# EasyEDA Pro project ProPrj_K230_2026-10-28.epro, schematic 主板原理图, sheets 1 to 10 of 13

## Sheets
1 Power Architecture Block: Board Name: 立创·庐山派K230-CanMV开发板; Create Date: 2024-11-28; Page Name: Power Architecture Block; Project Name: 立创·庐山派K230-CanMV开发板; Schematic Name: 主板原理图; Update Date: 2025-11-04; Company: 嘉立创EDA; Drawed: LCKFB-YZH; Page Size: A4; Version: V1.0
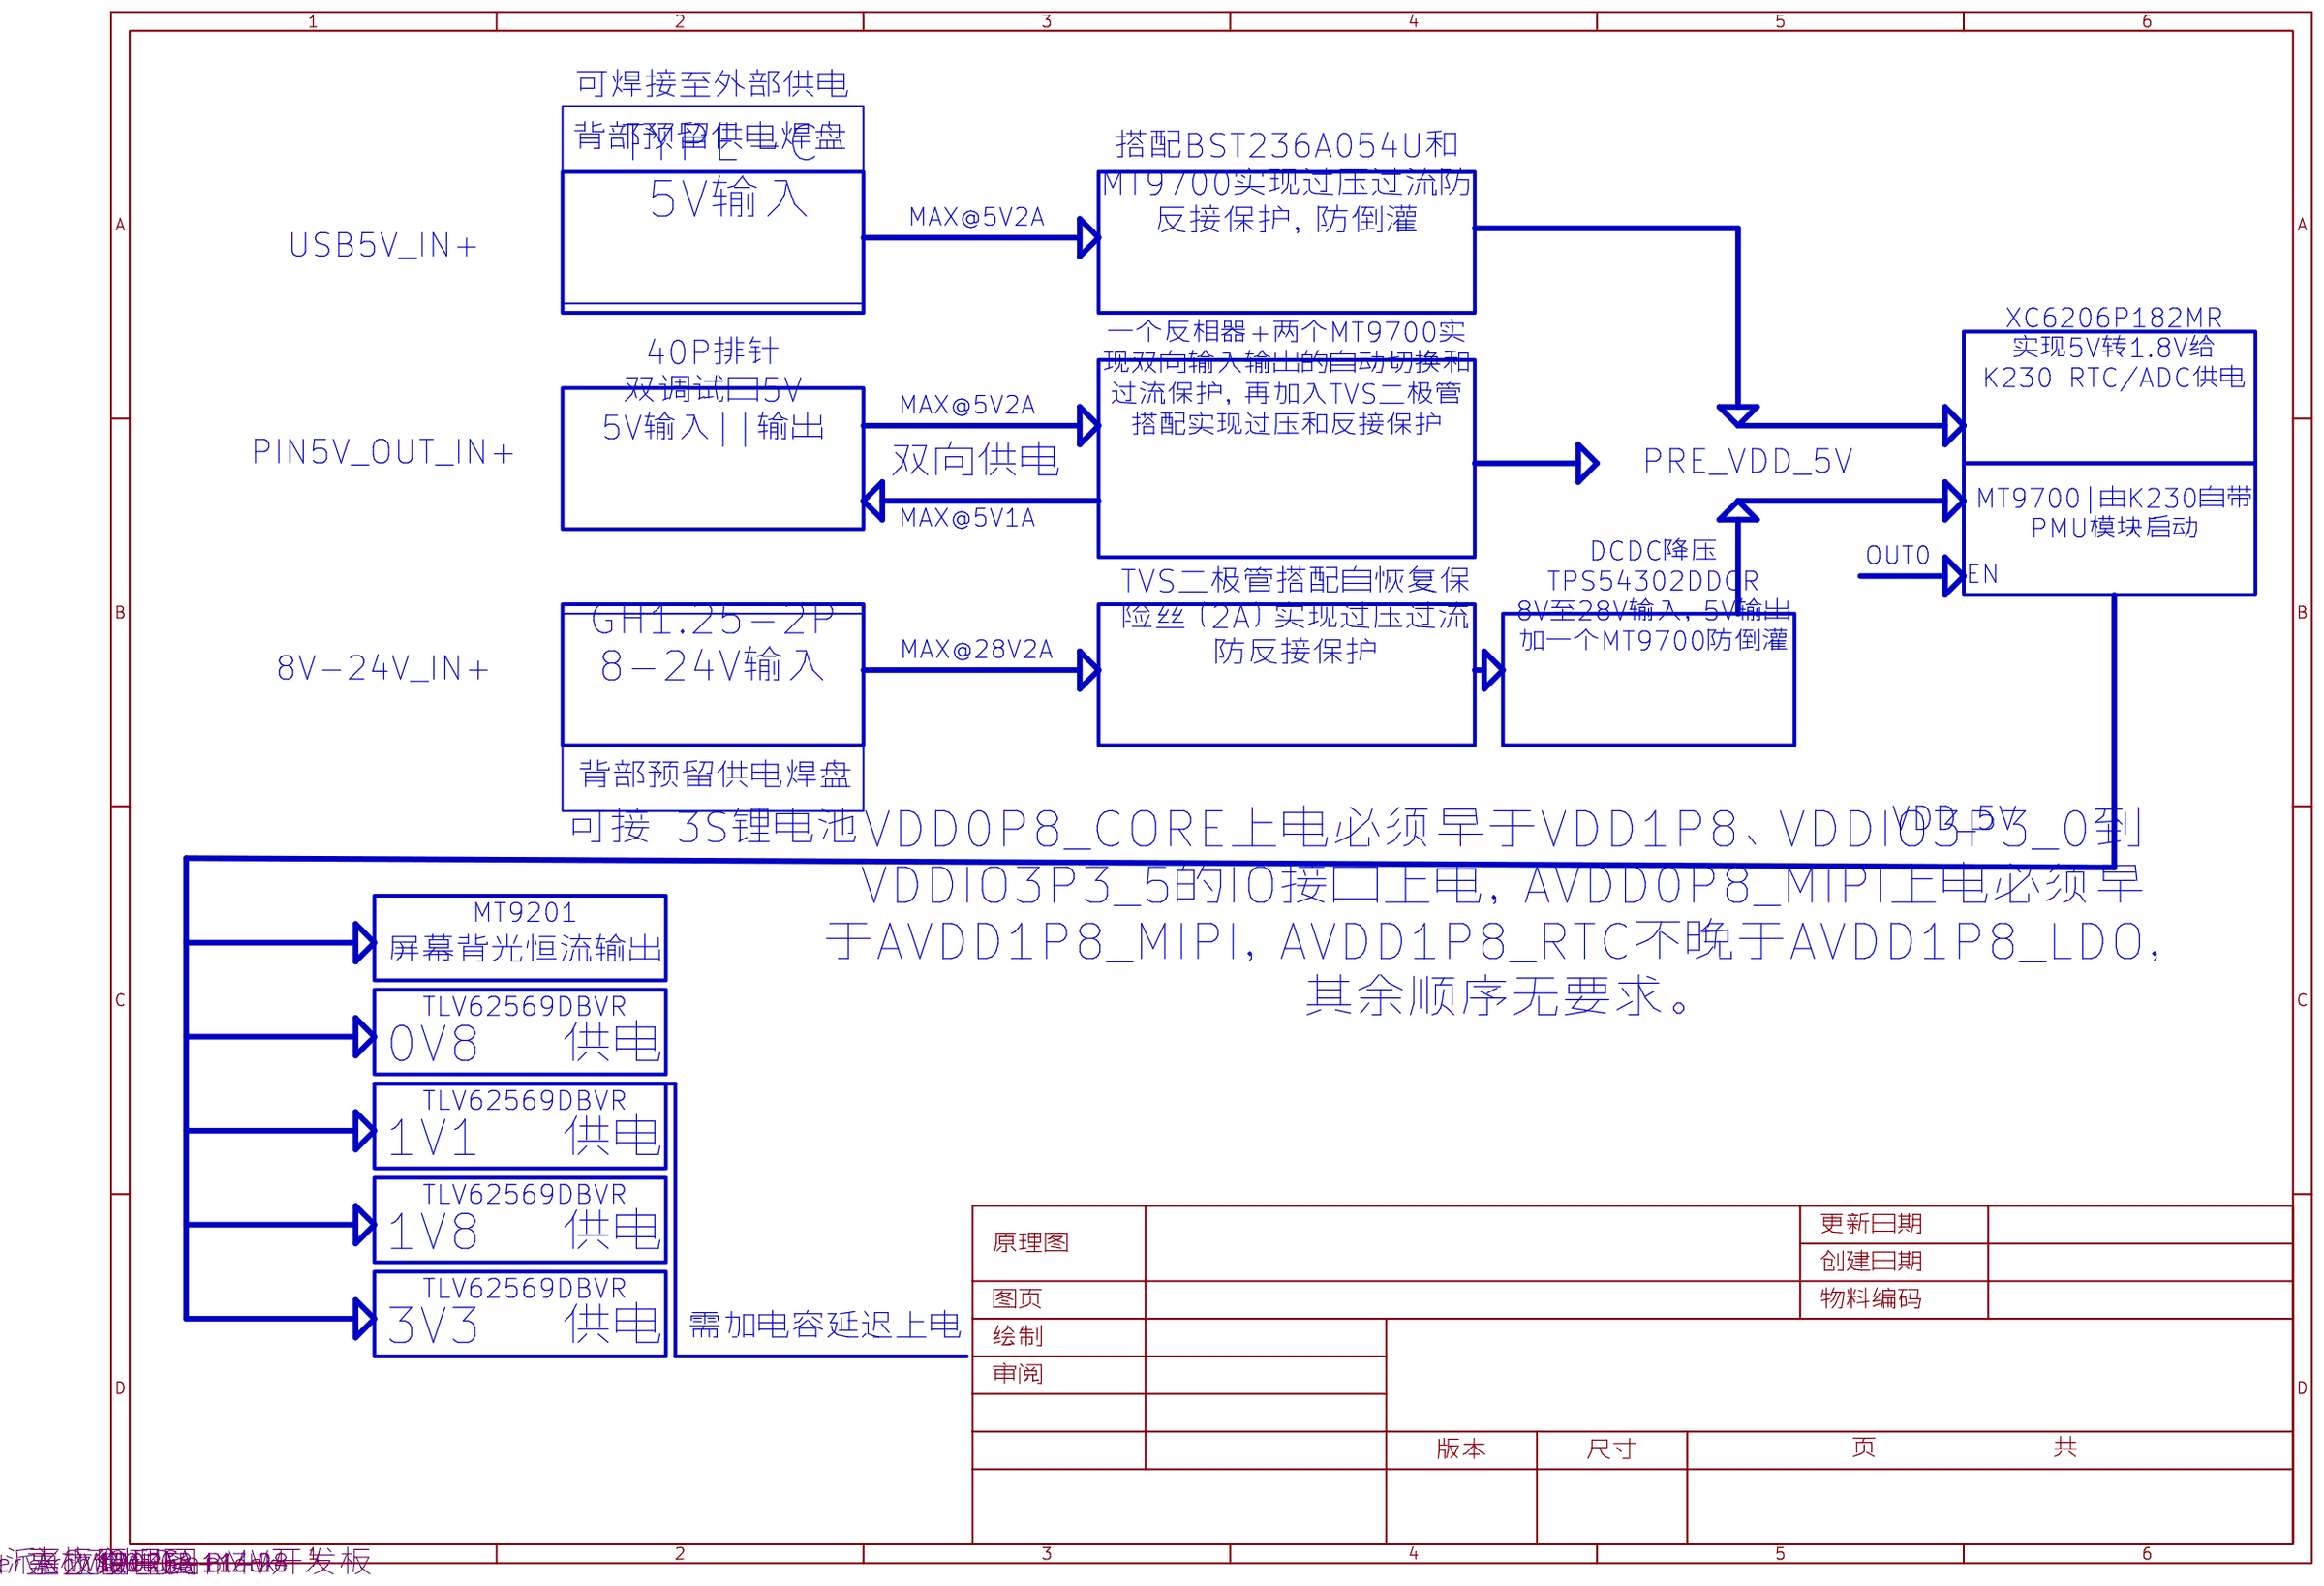
[diagram p0: Power Architecture Block]
2 K230 GPIO: Page Name: K230 GPIO; Update Date: 2024-11-28
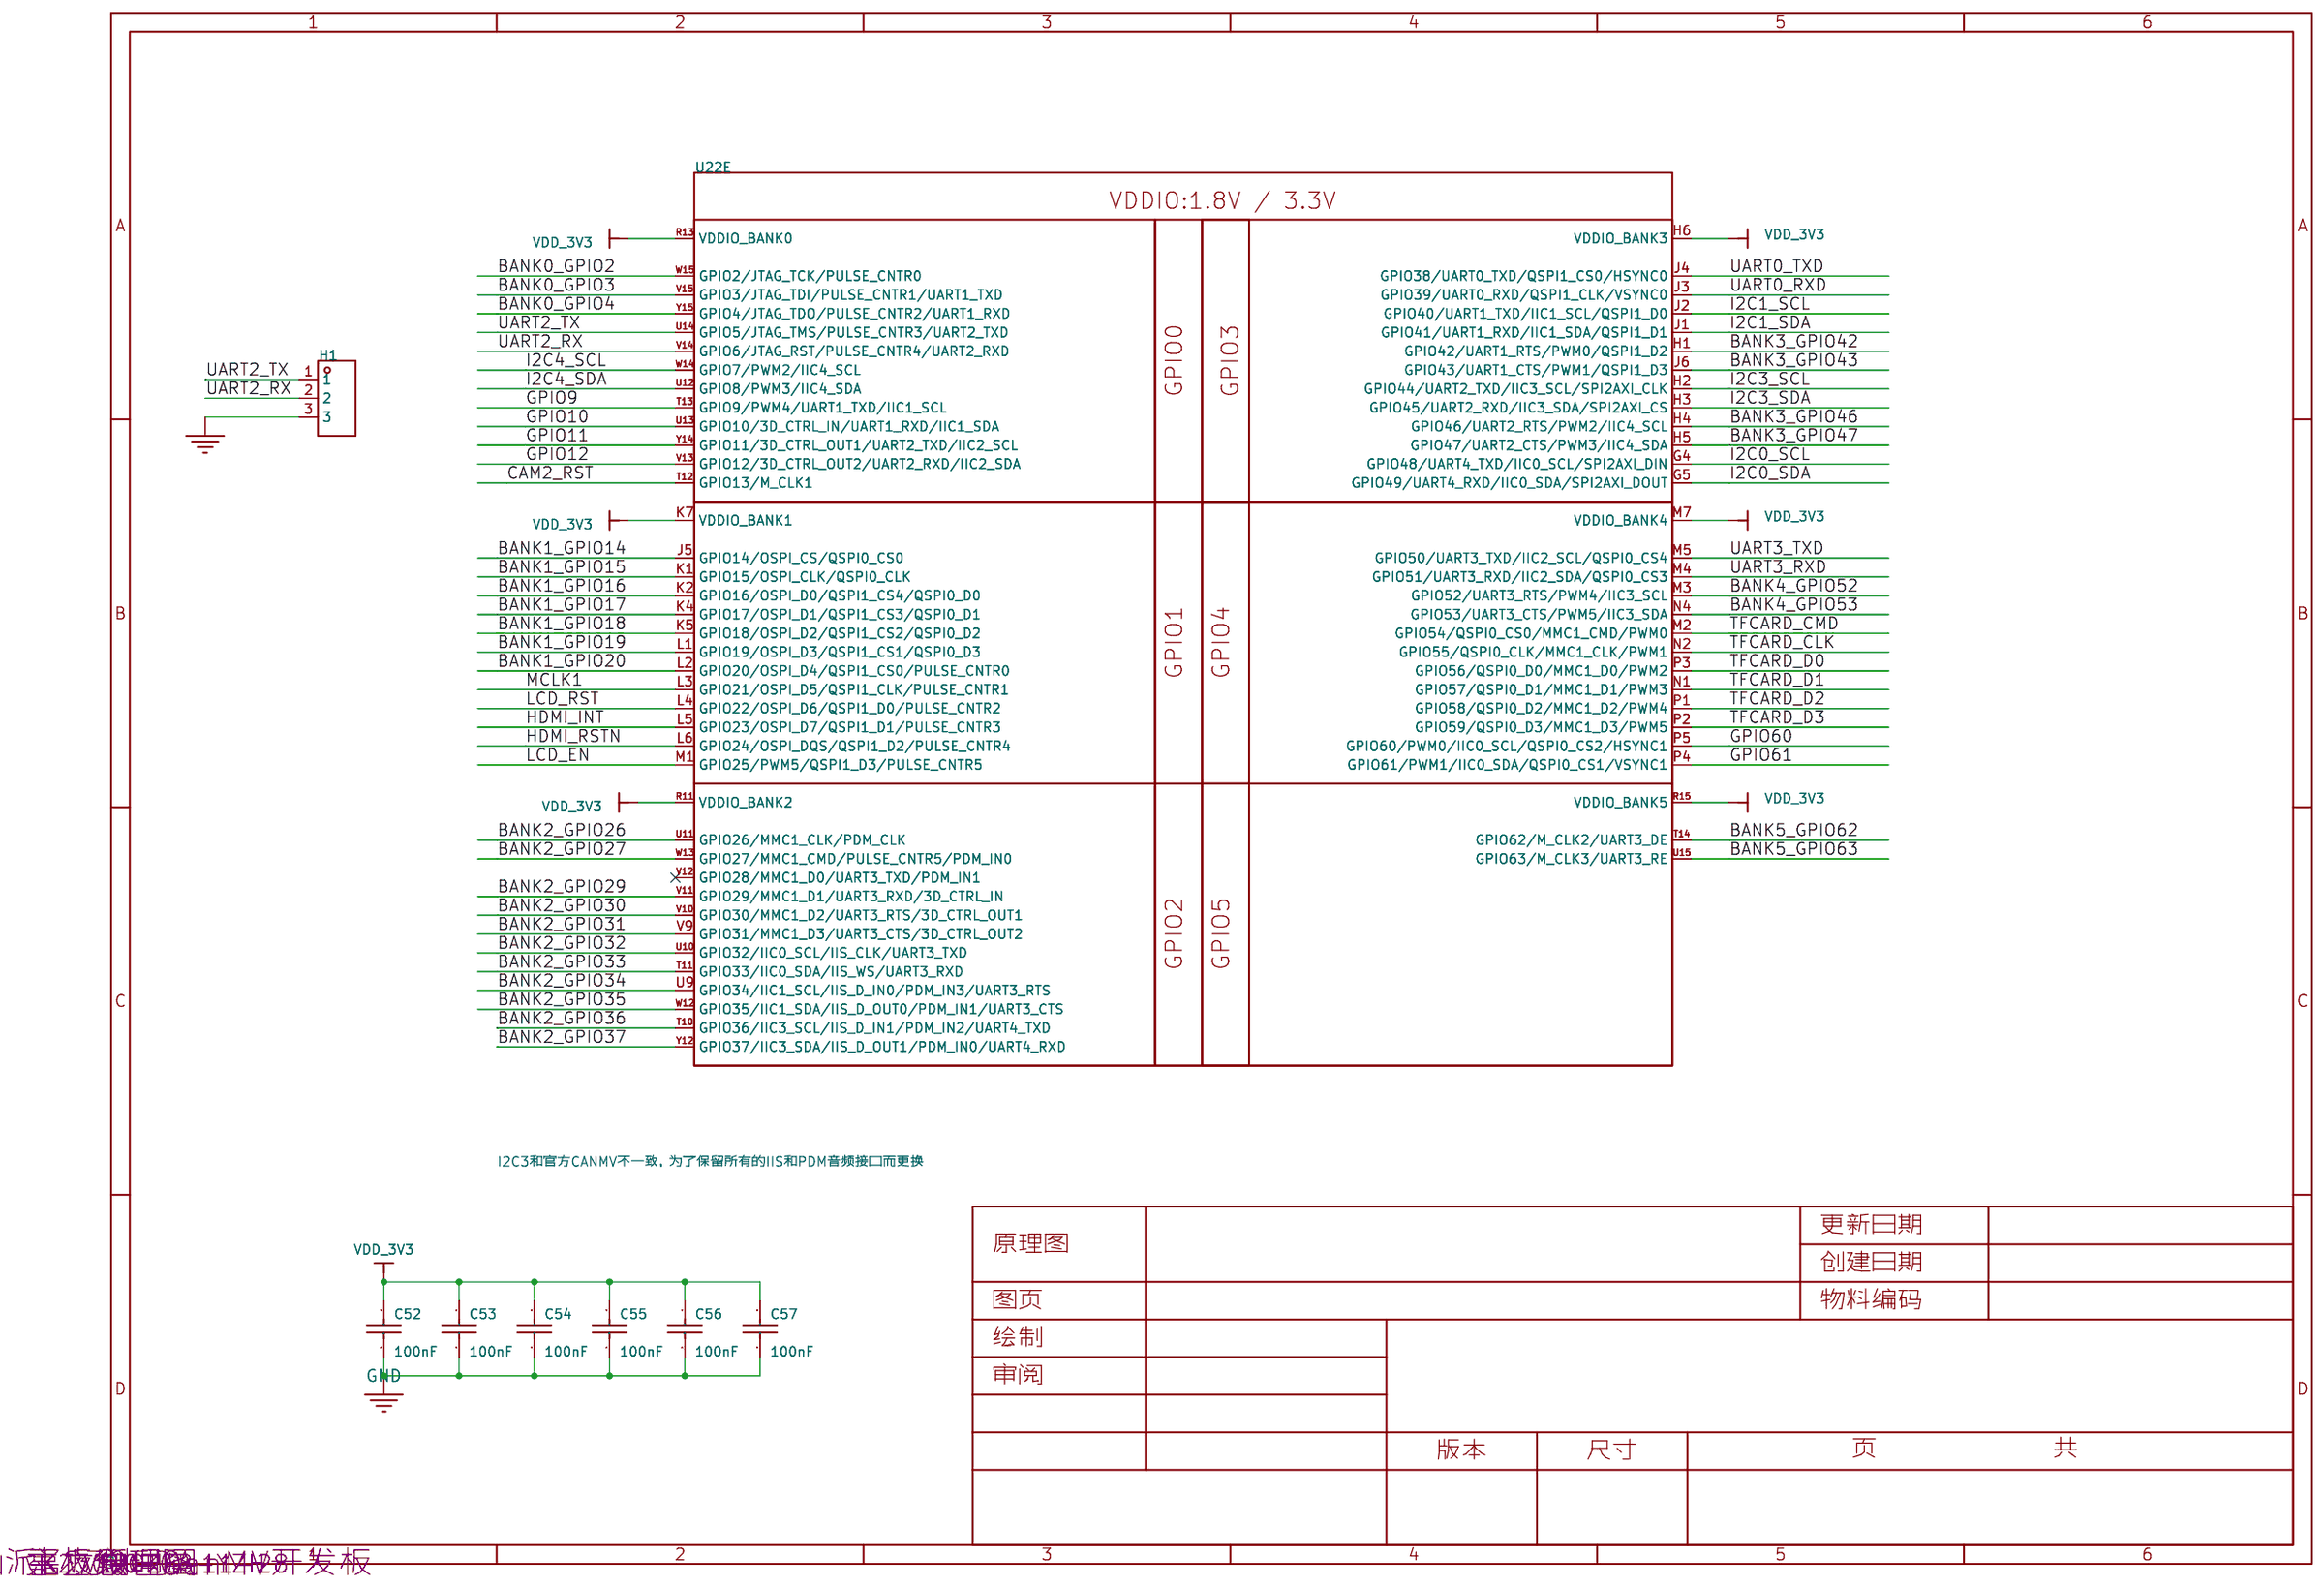
[diagram p1: K230 GPIO]
3 Power SUPPLY USB AND PIN: Page Name: Power SUPPLY USB AND PIN; Update Date: 2024-11-28
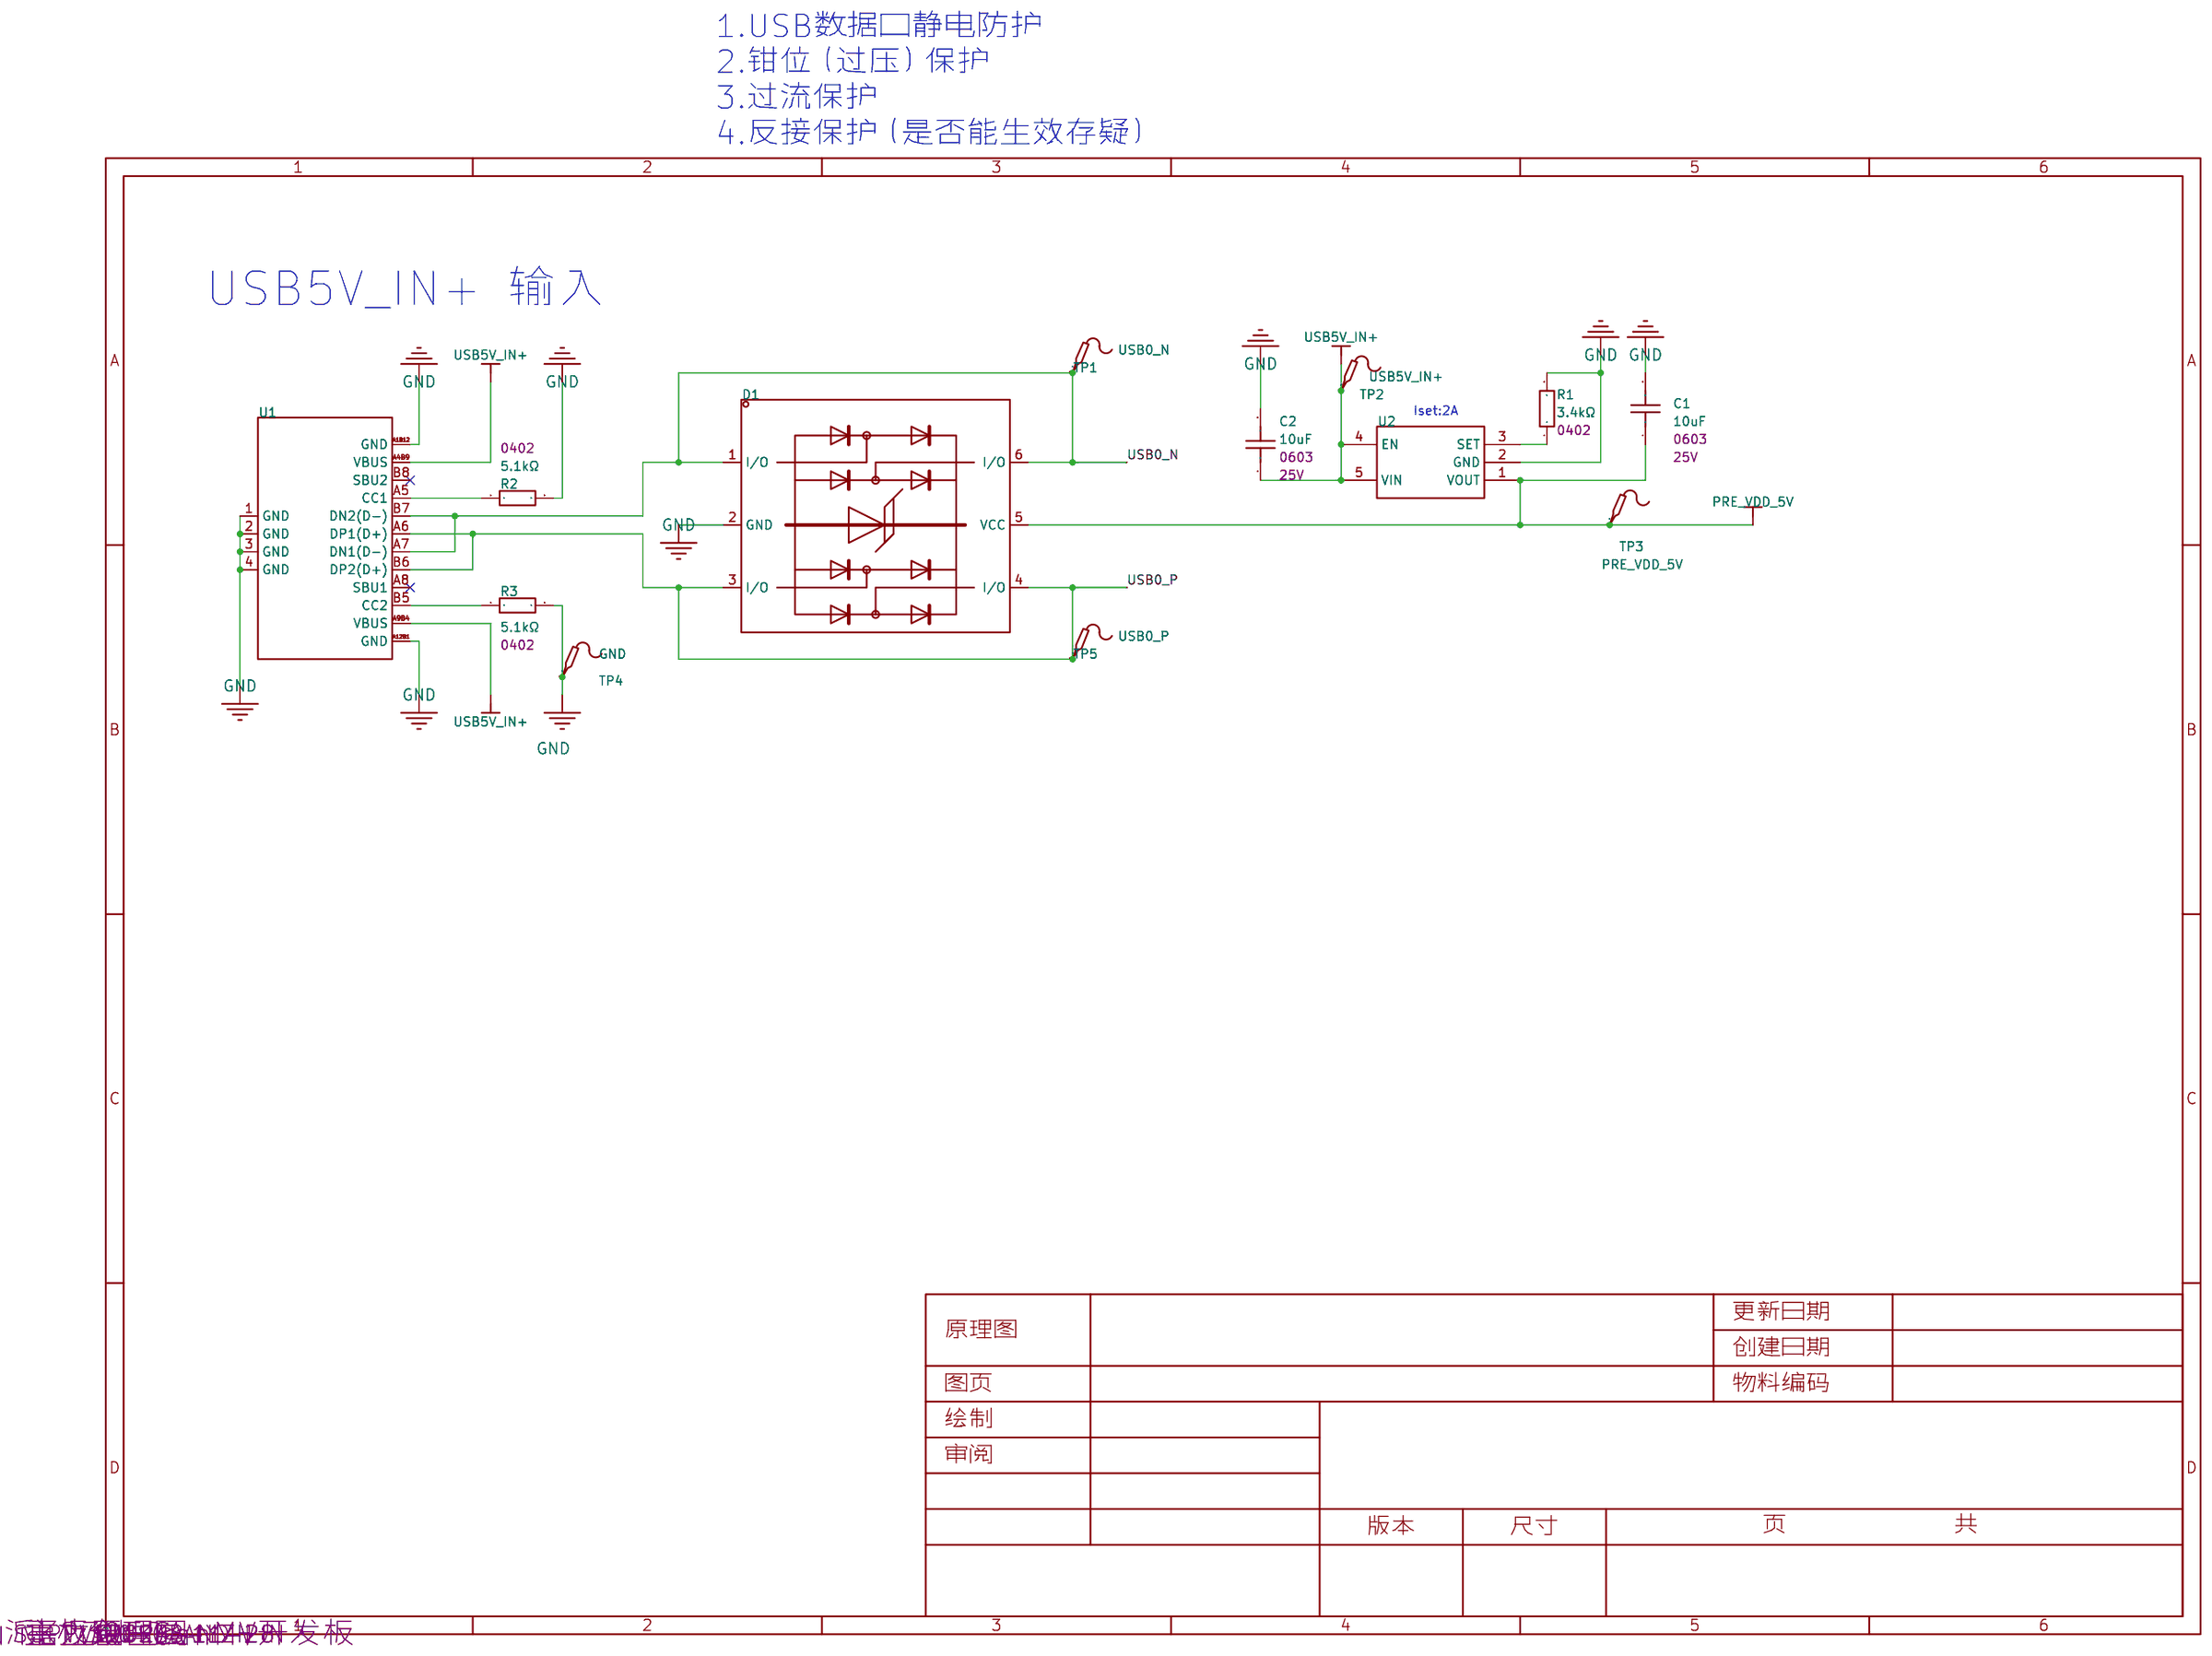
[diagram p2: Power SUPPLY USB AND PIN]
4 Power SUPPLY 8-24V: Page Name: Power SUPPLY 8-24V; Update Date: 2024-11-28
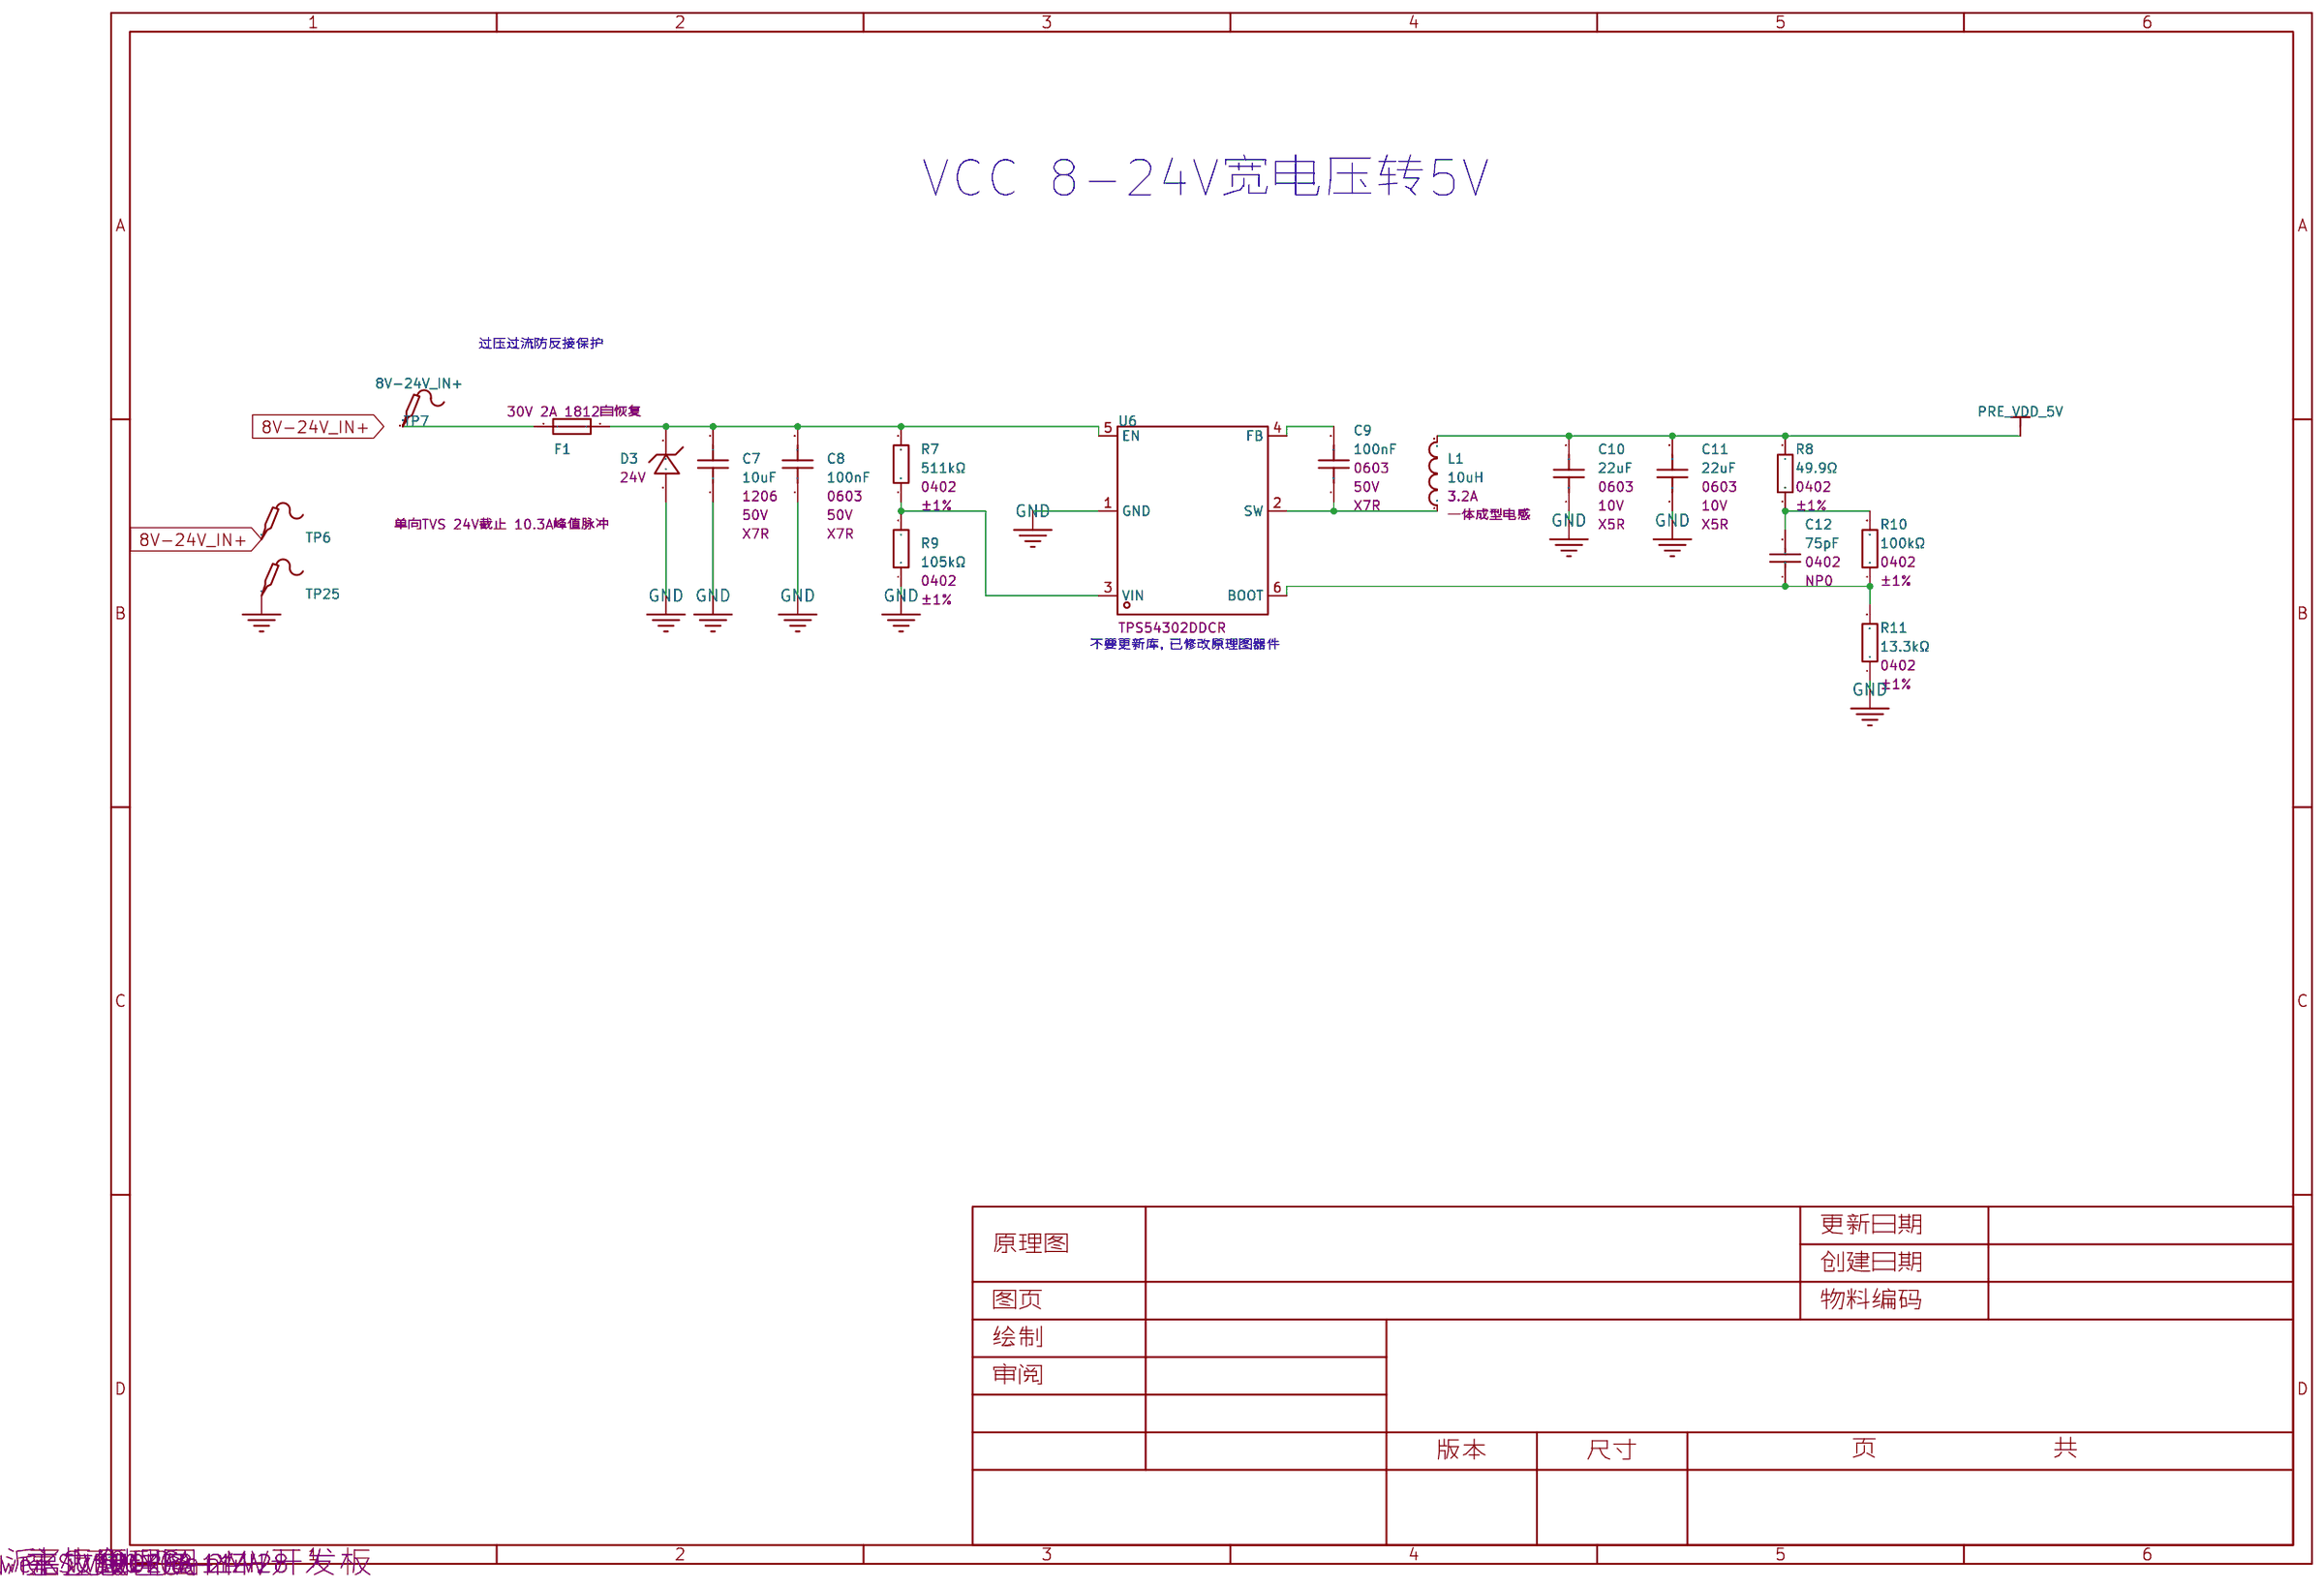
[diagram p3: Power SUPPLY 8-24V]
5 DBG AUDIO KEY LED: Page Name: DBG AUDIO KEY LED; Update Date: 2024-11-28
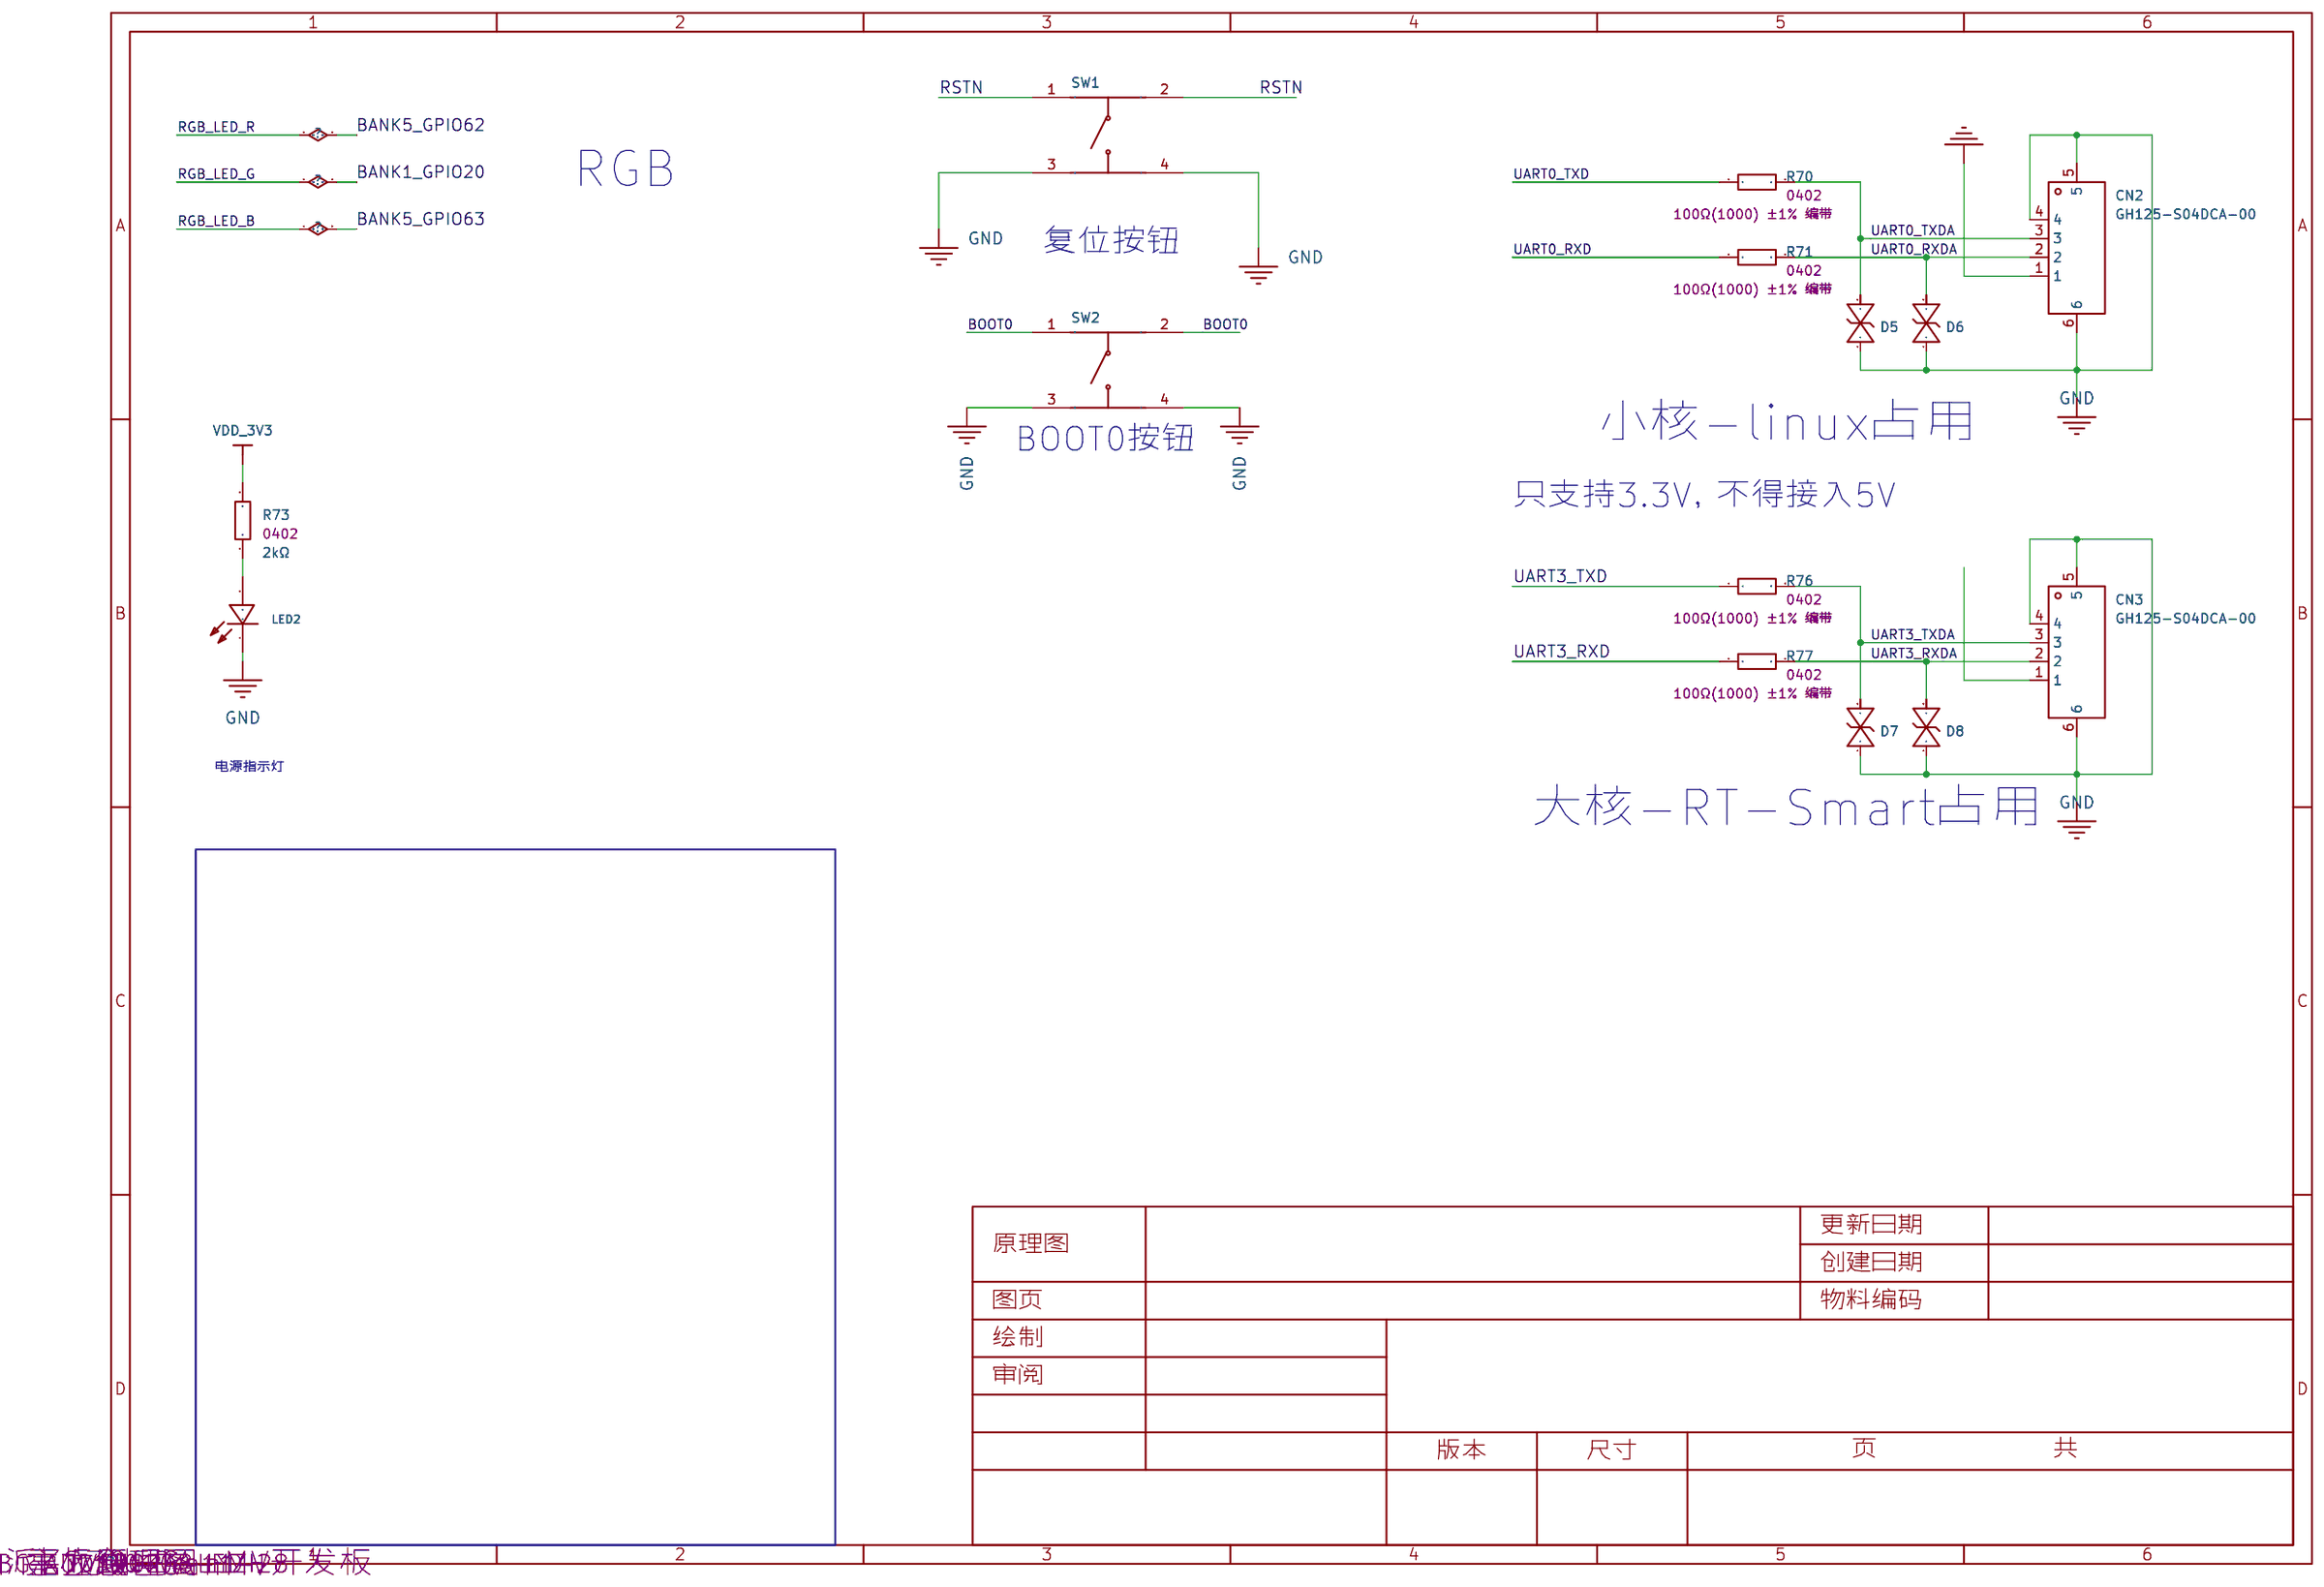
[diagram p4: DBG AUDIO KEY LED]
6 TF CARD OR SDNAND: Page Name: TF CARD OR SDNAND; Update Date: 2024-11-28
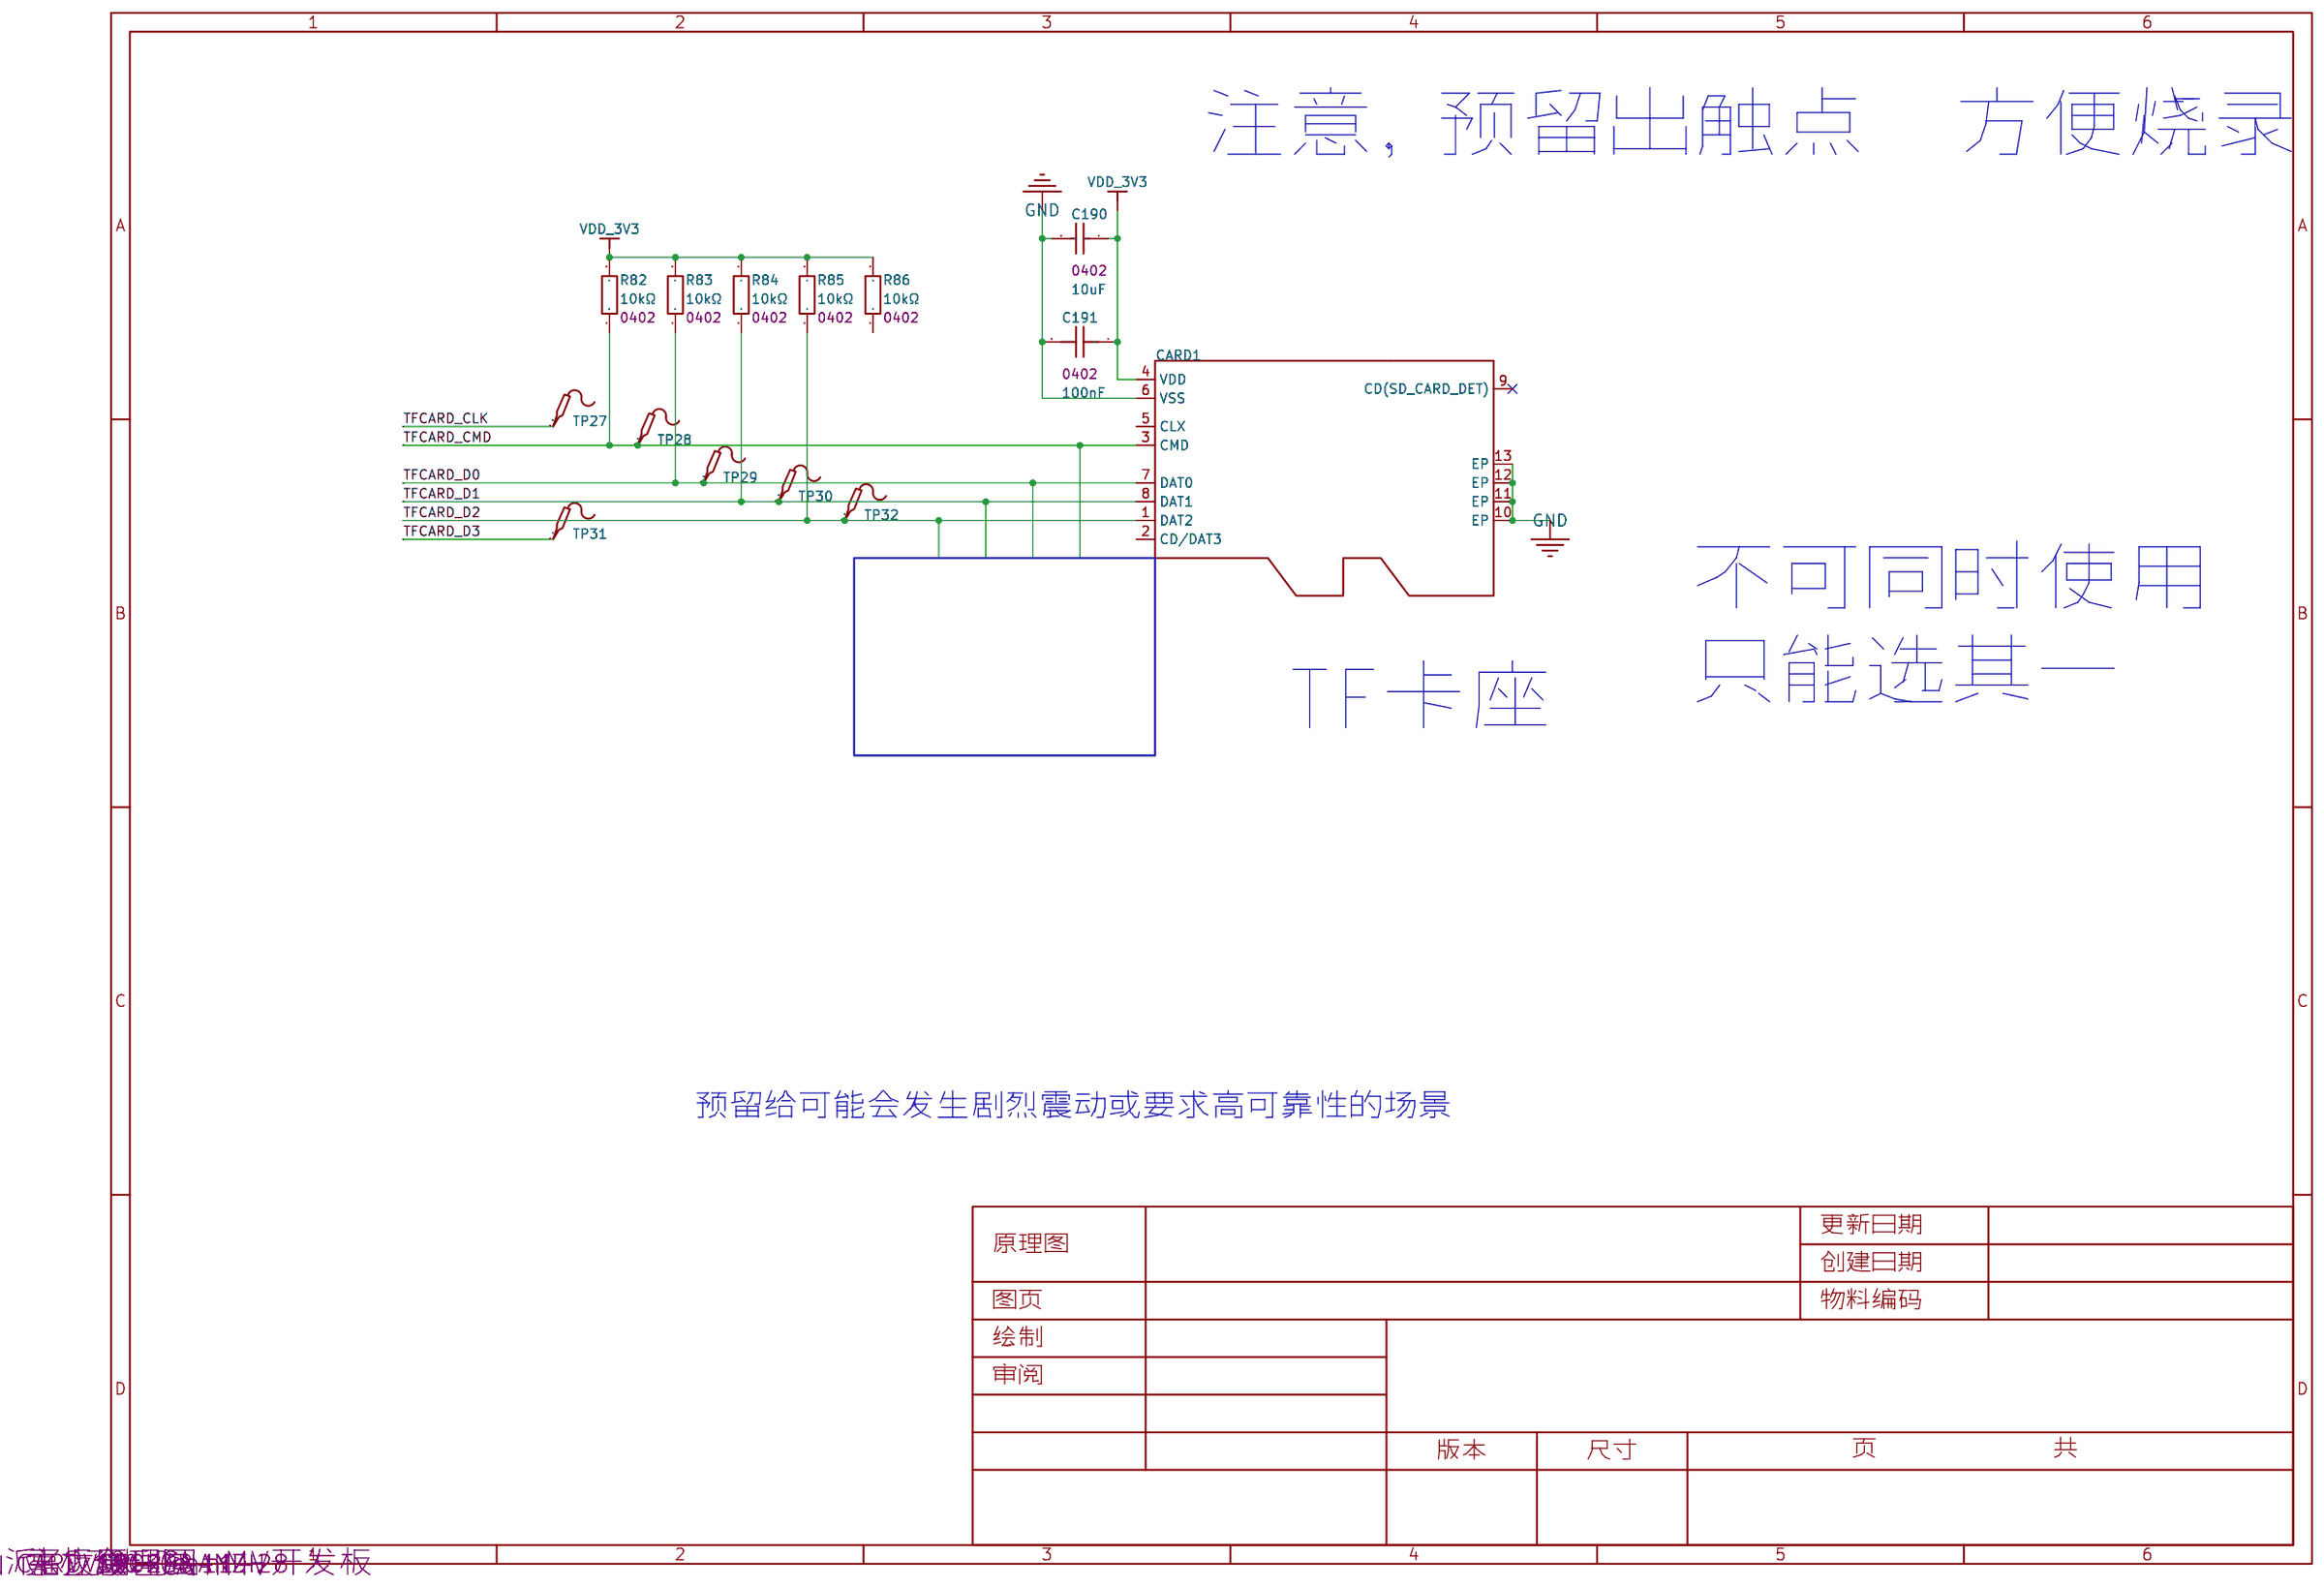
[diagram p5: TF CARD OR SDNAND]
7 Screw Holes: Page Name: Screw Holes; Update Date: 2024-11-28
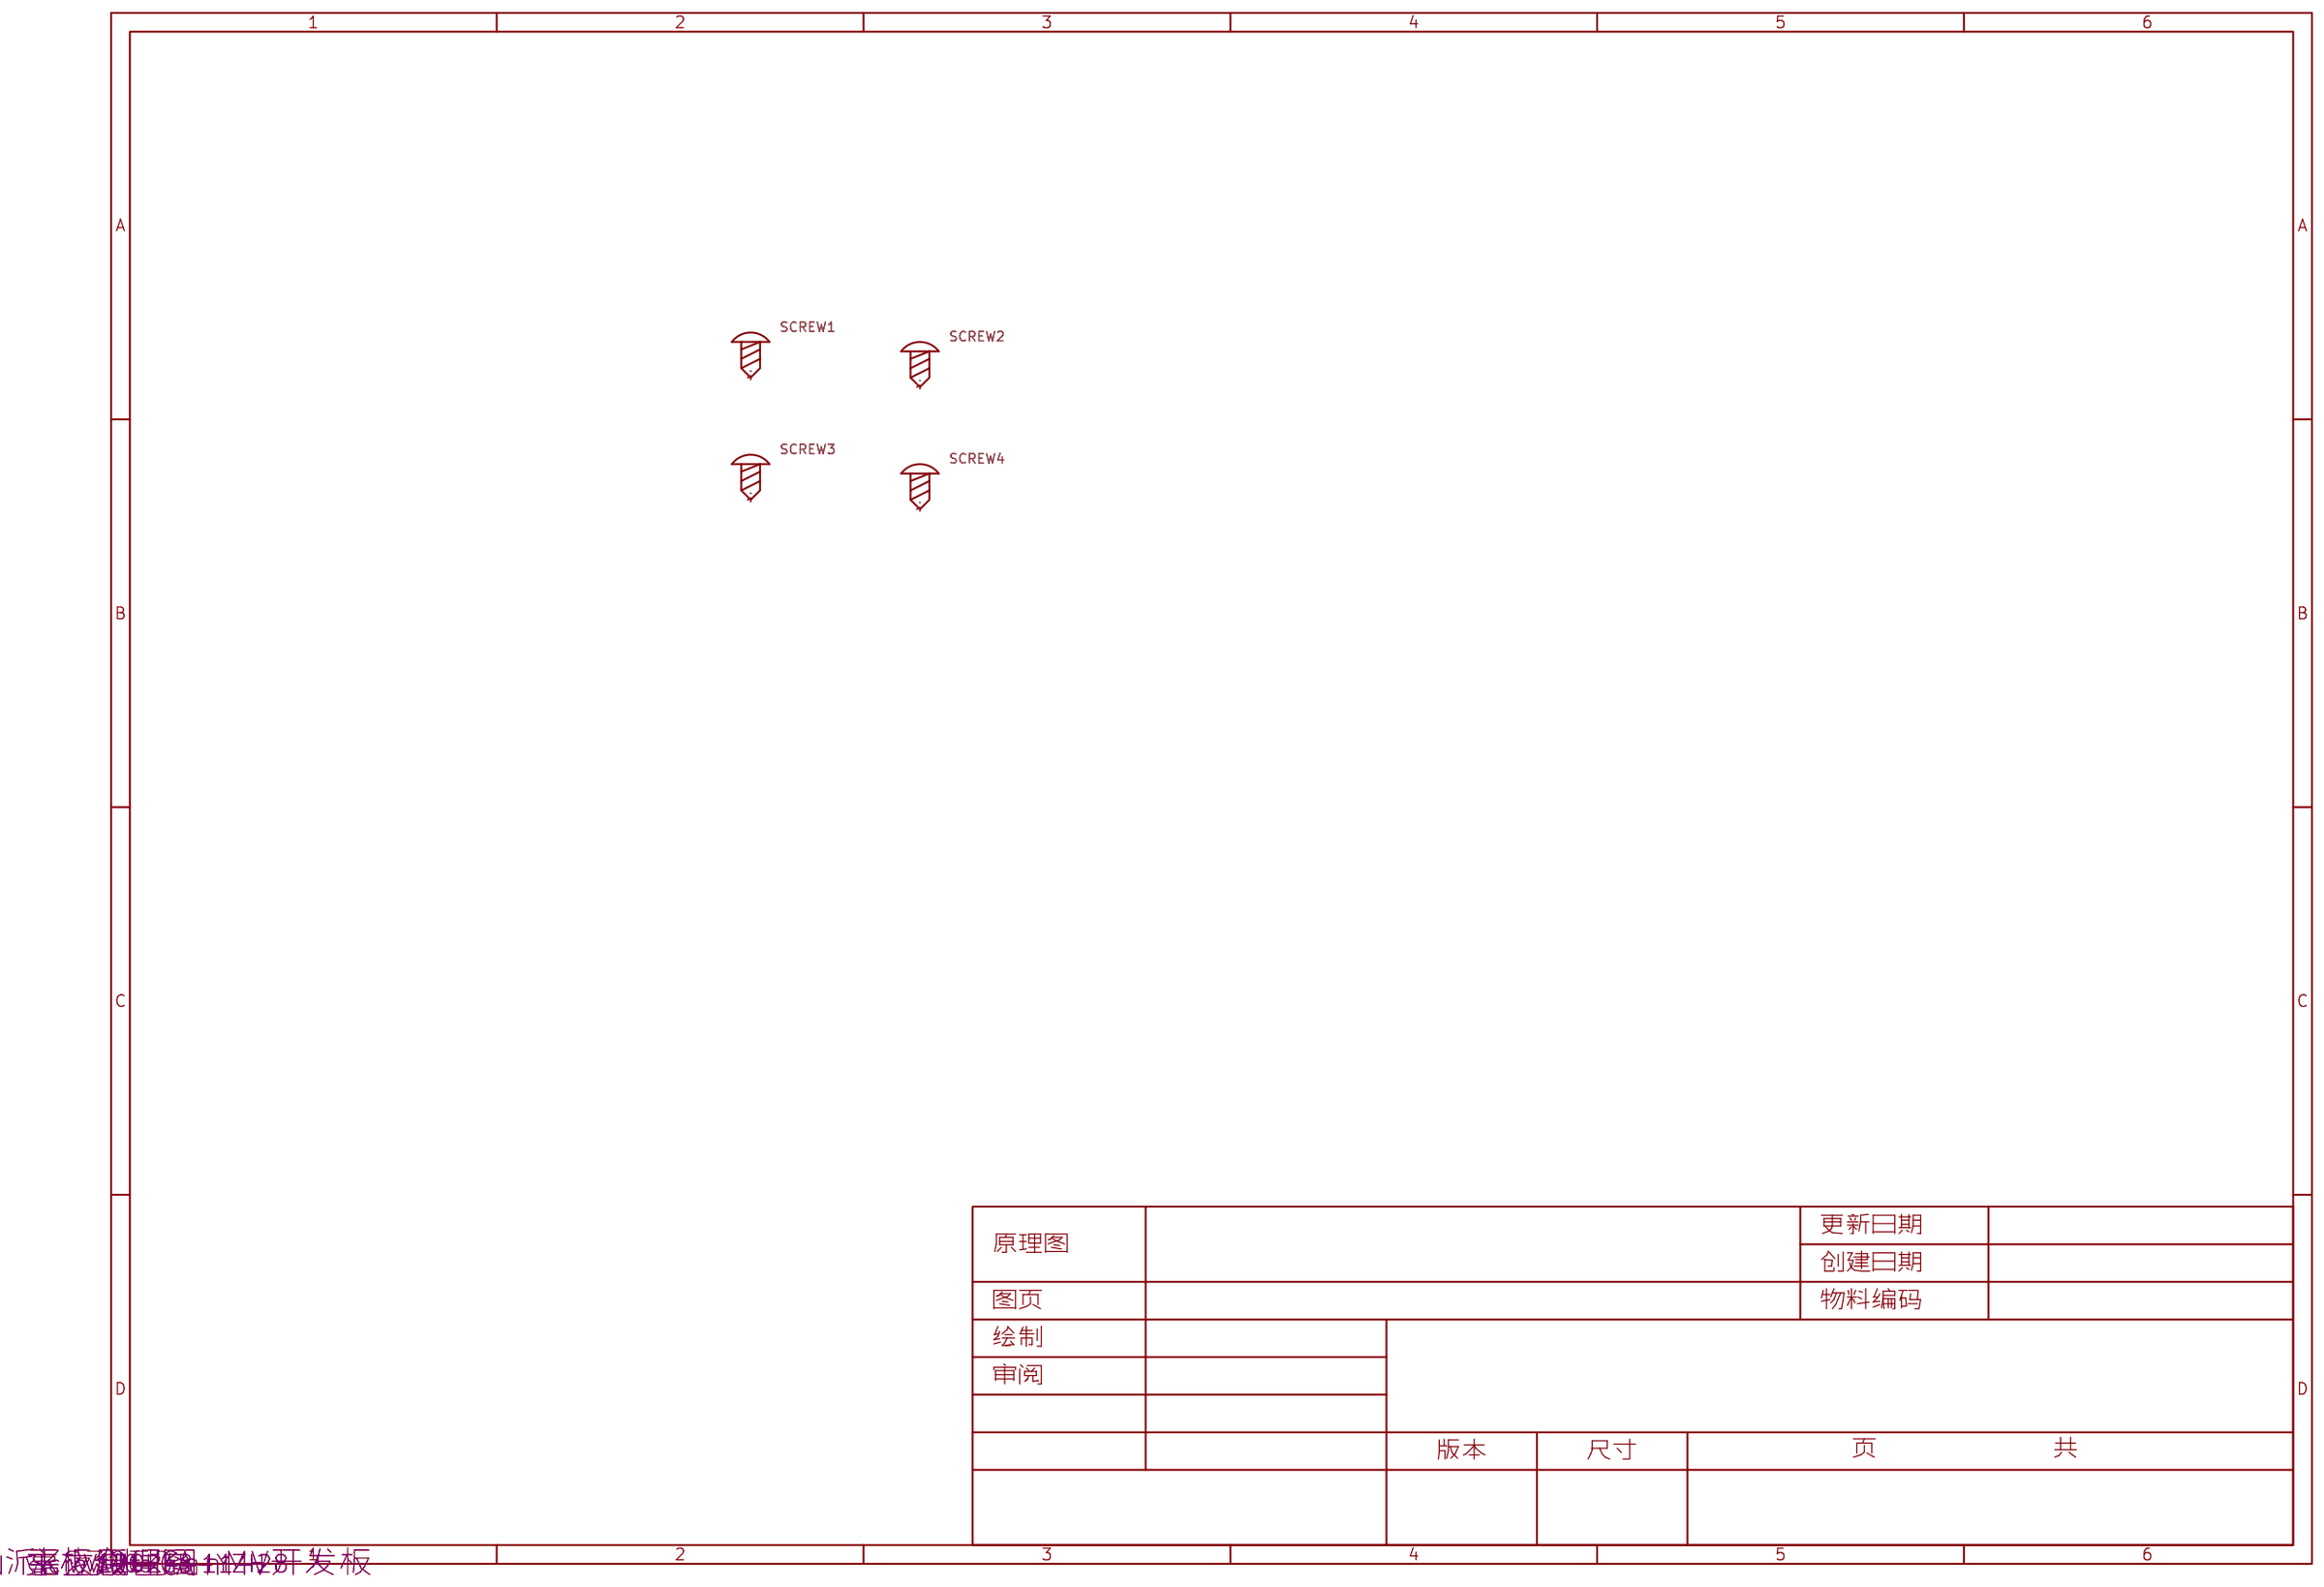
[diagram p6: Screw Holes]
8 K230 BOOT: Page Name: K230 BOOT; Update Date: 2024-11-28
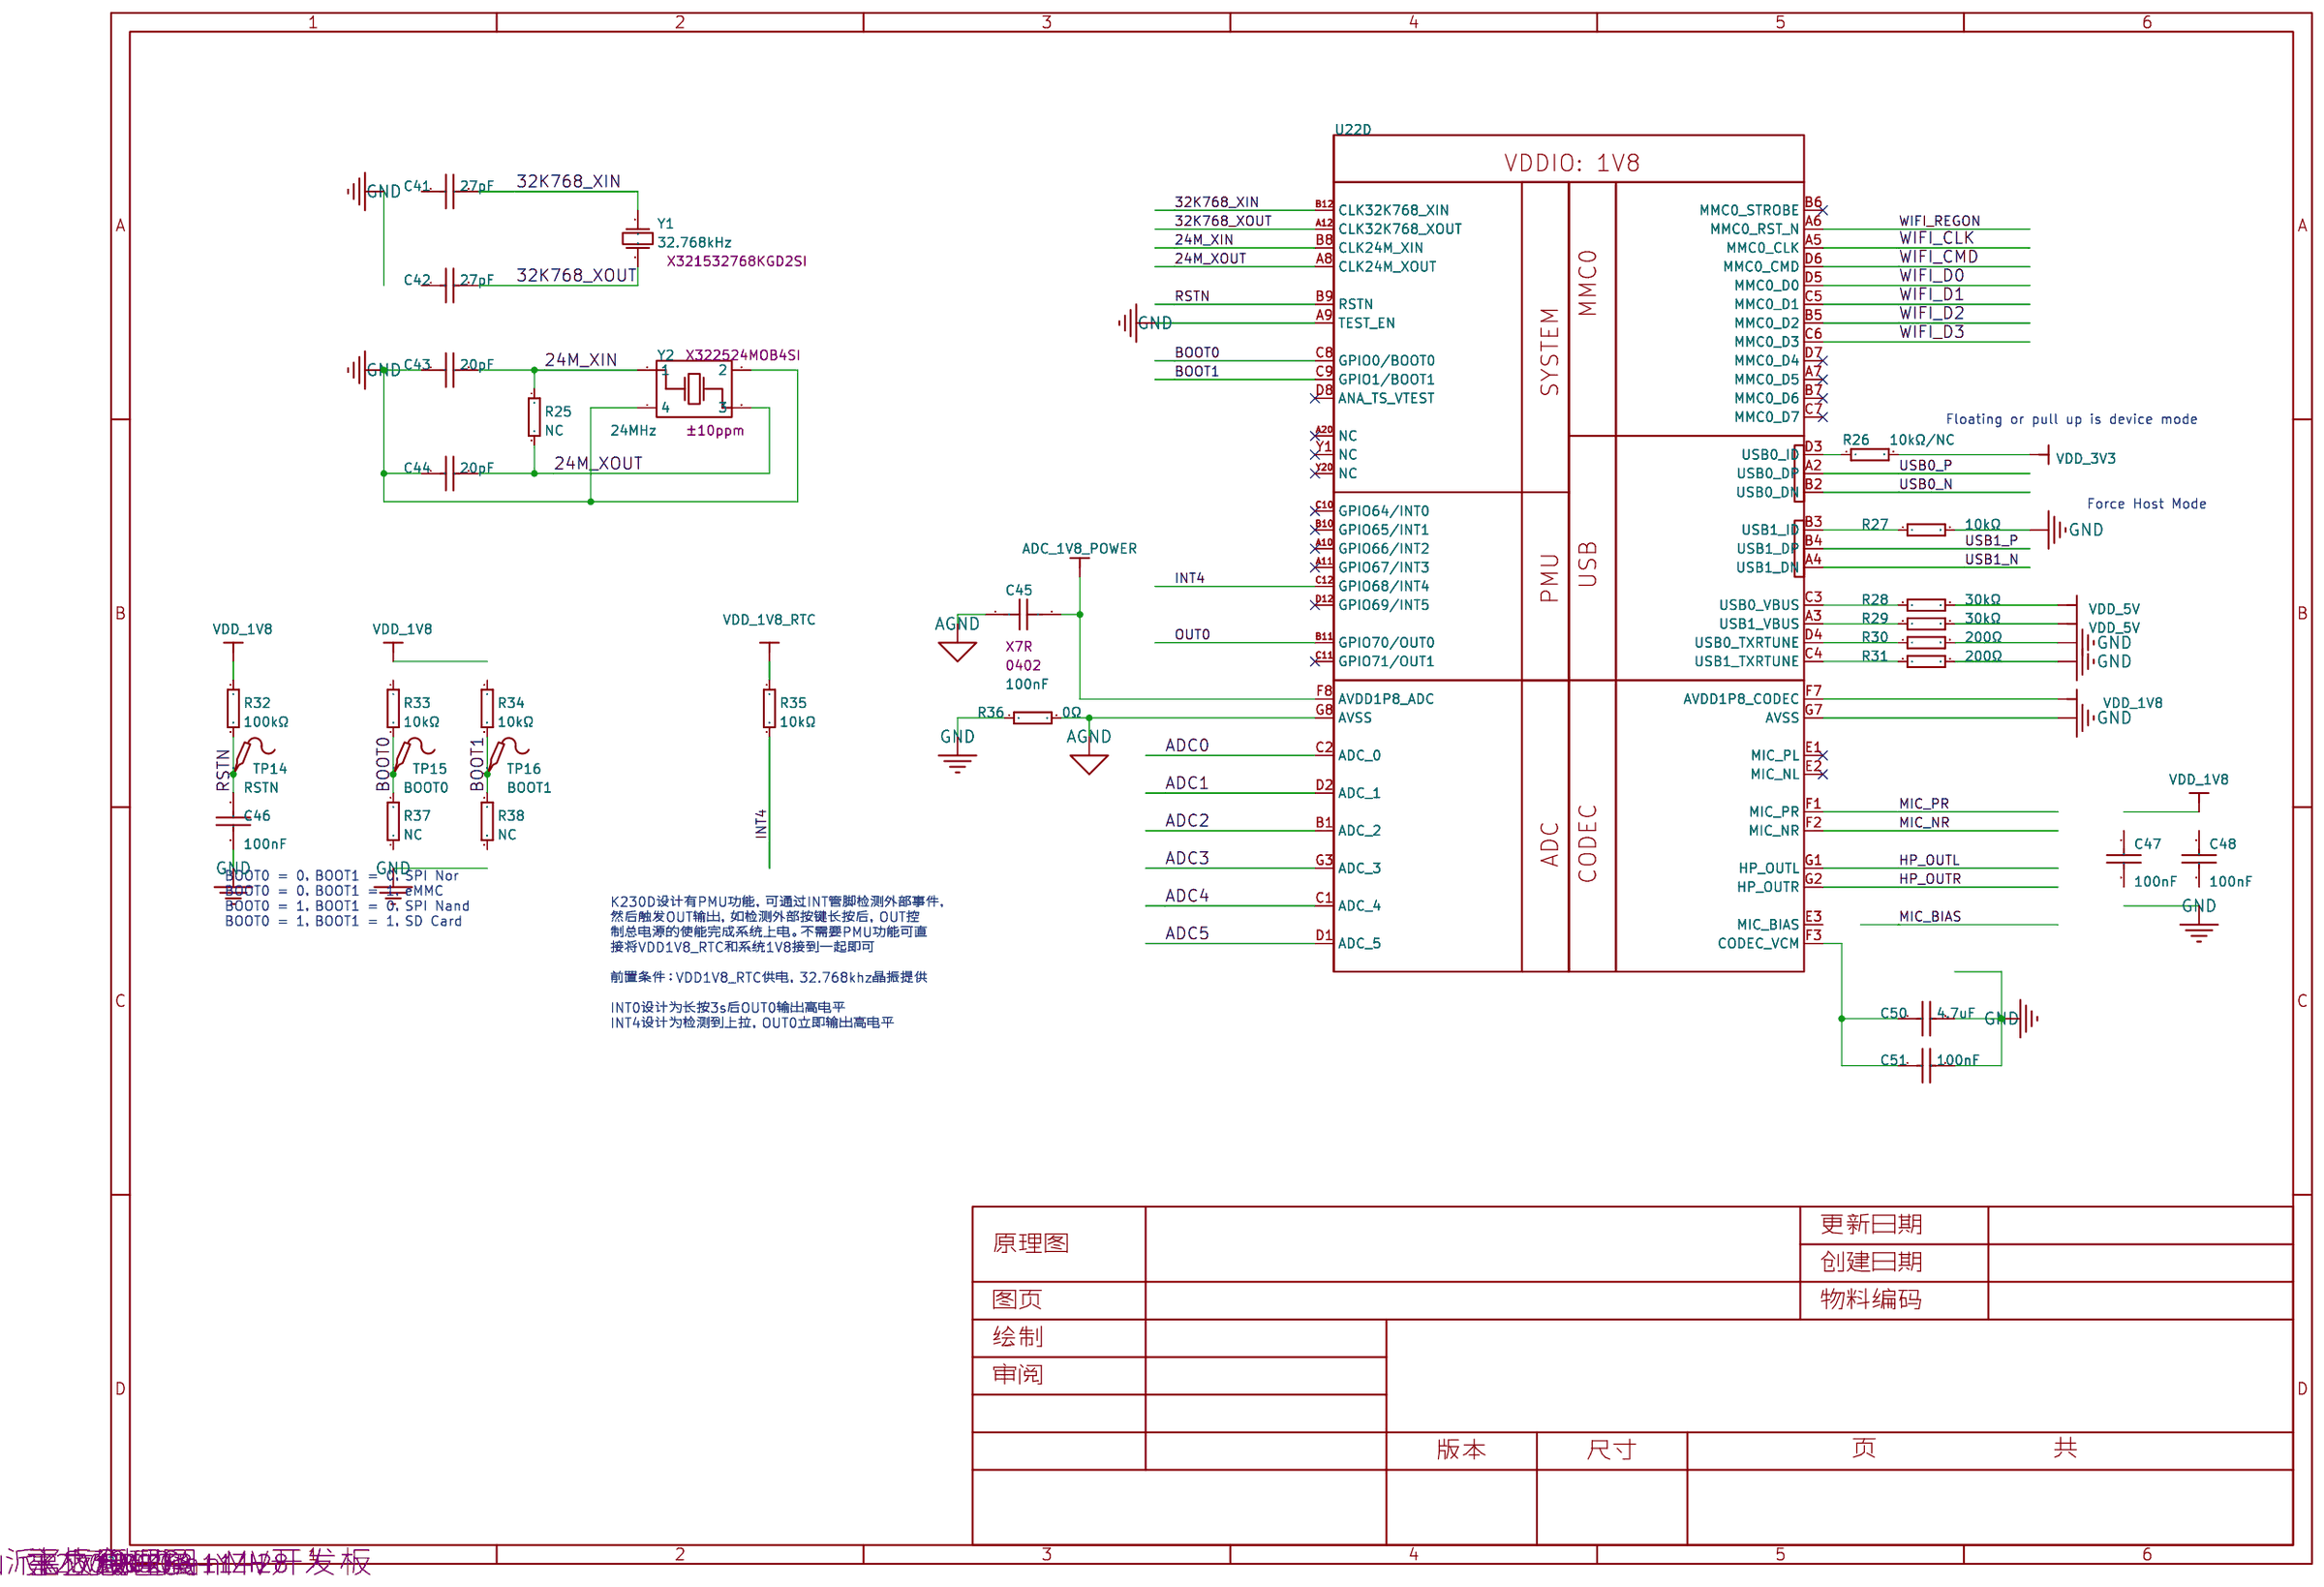
[diagram p7: K230 BOOT]
9 LPDDR4: Page Name: LPDDR4; Update Date: 2024-11-28
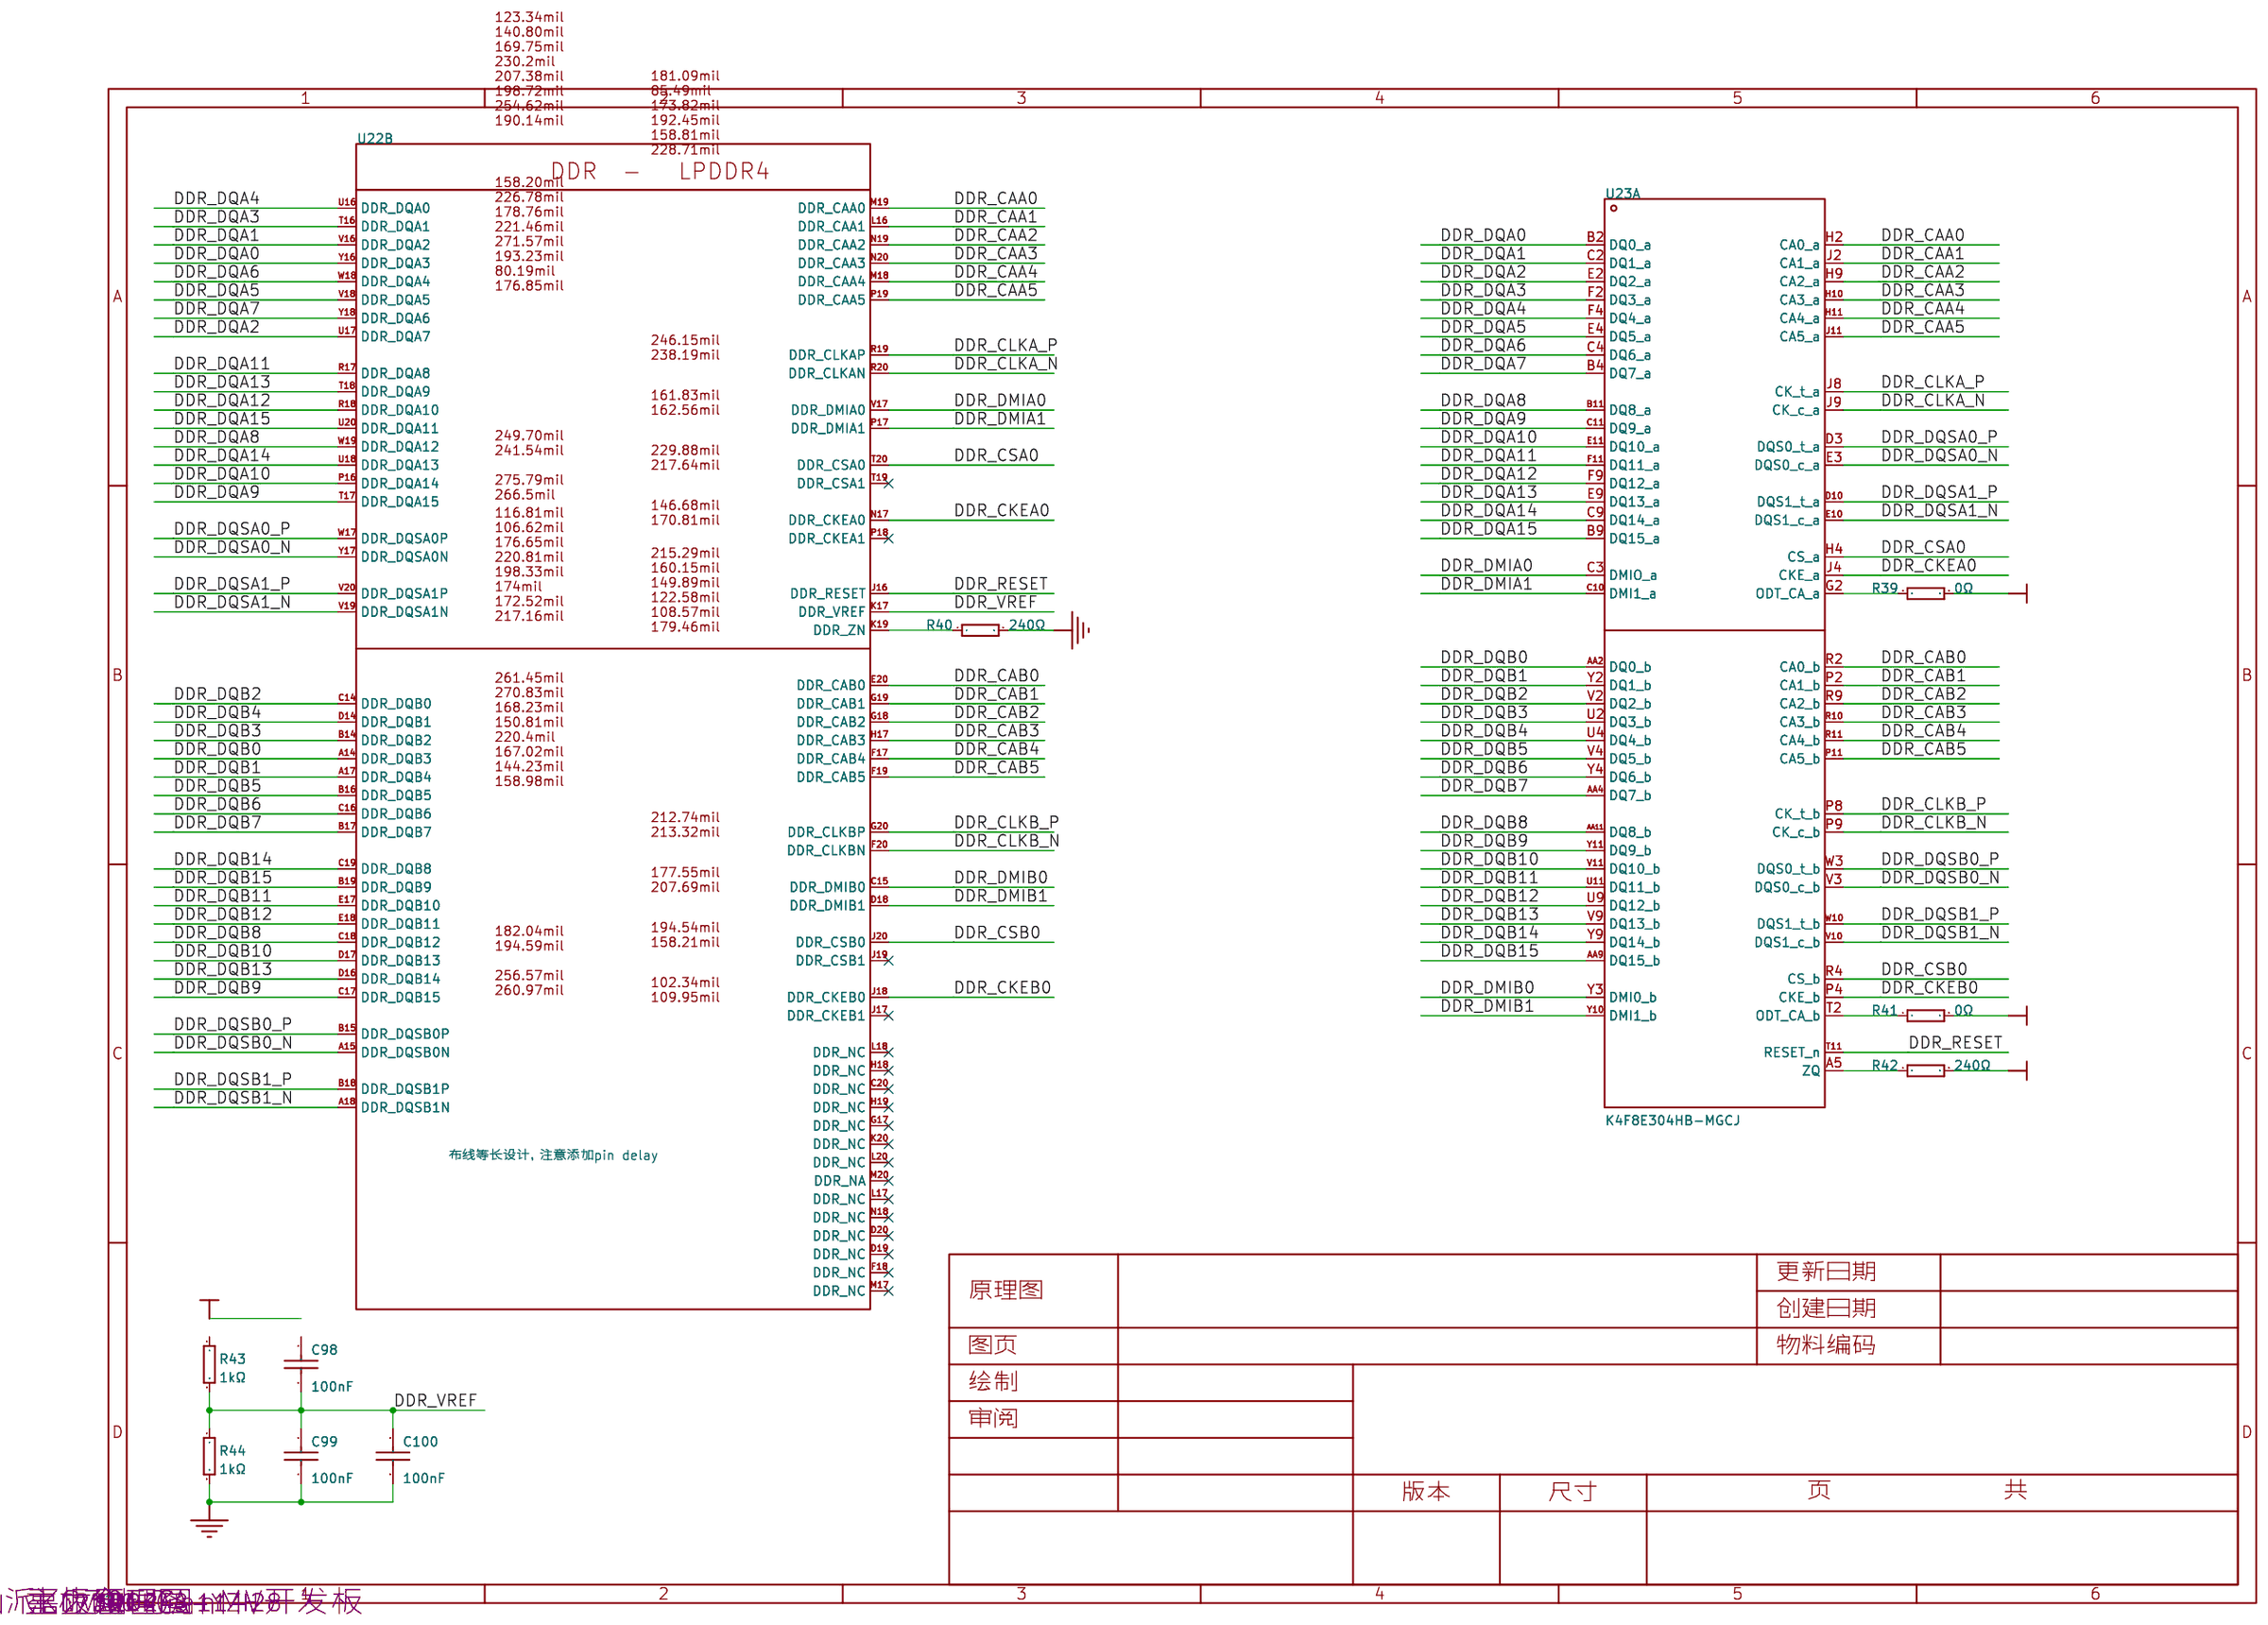
[diagram p8: LPDDR4]
10 CSI INTERFACE: Page Name: CSI INTERFACE; Update Date: 2024-11-28
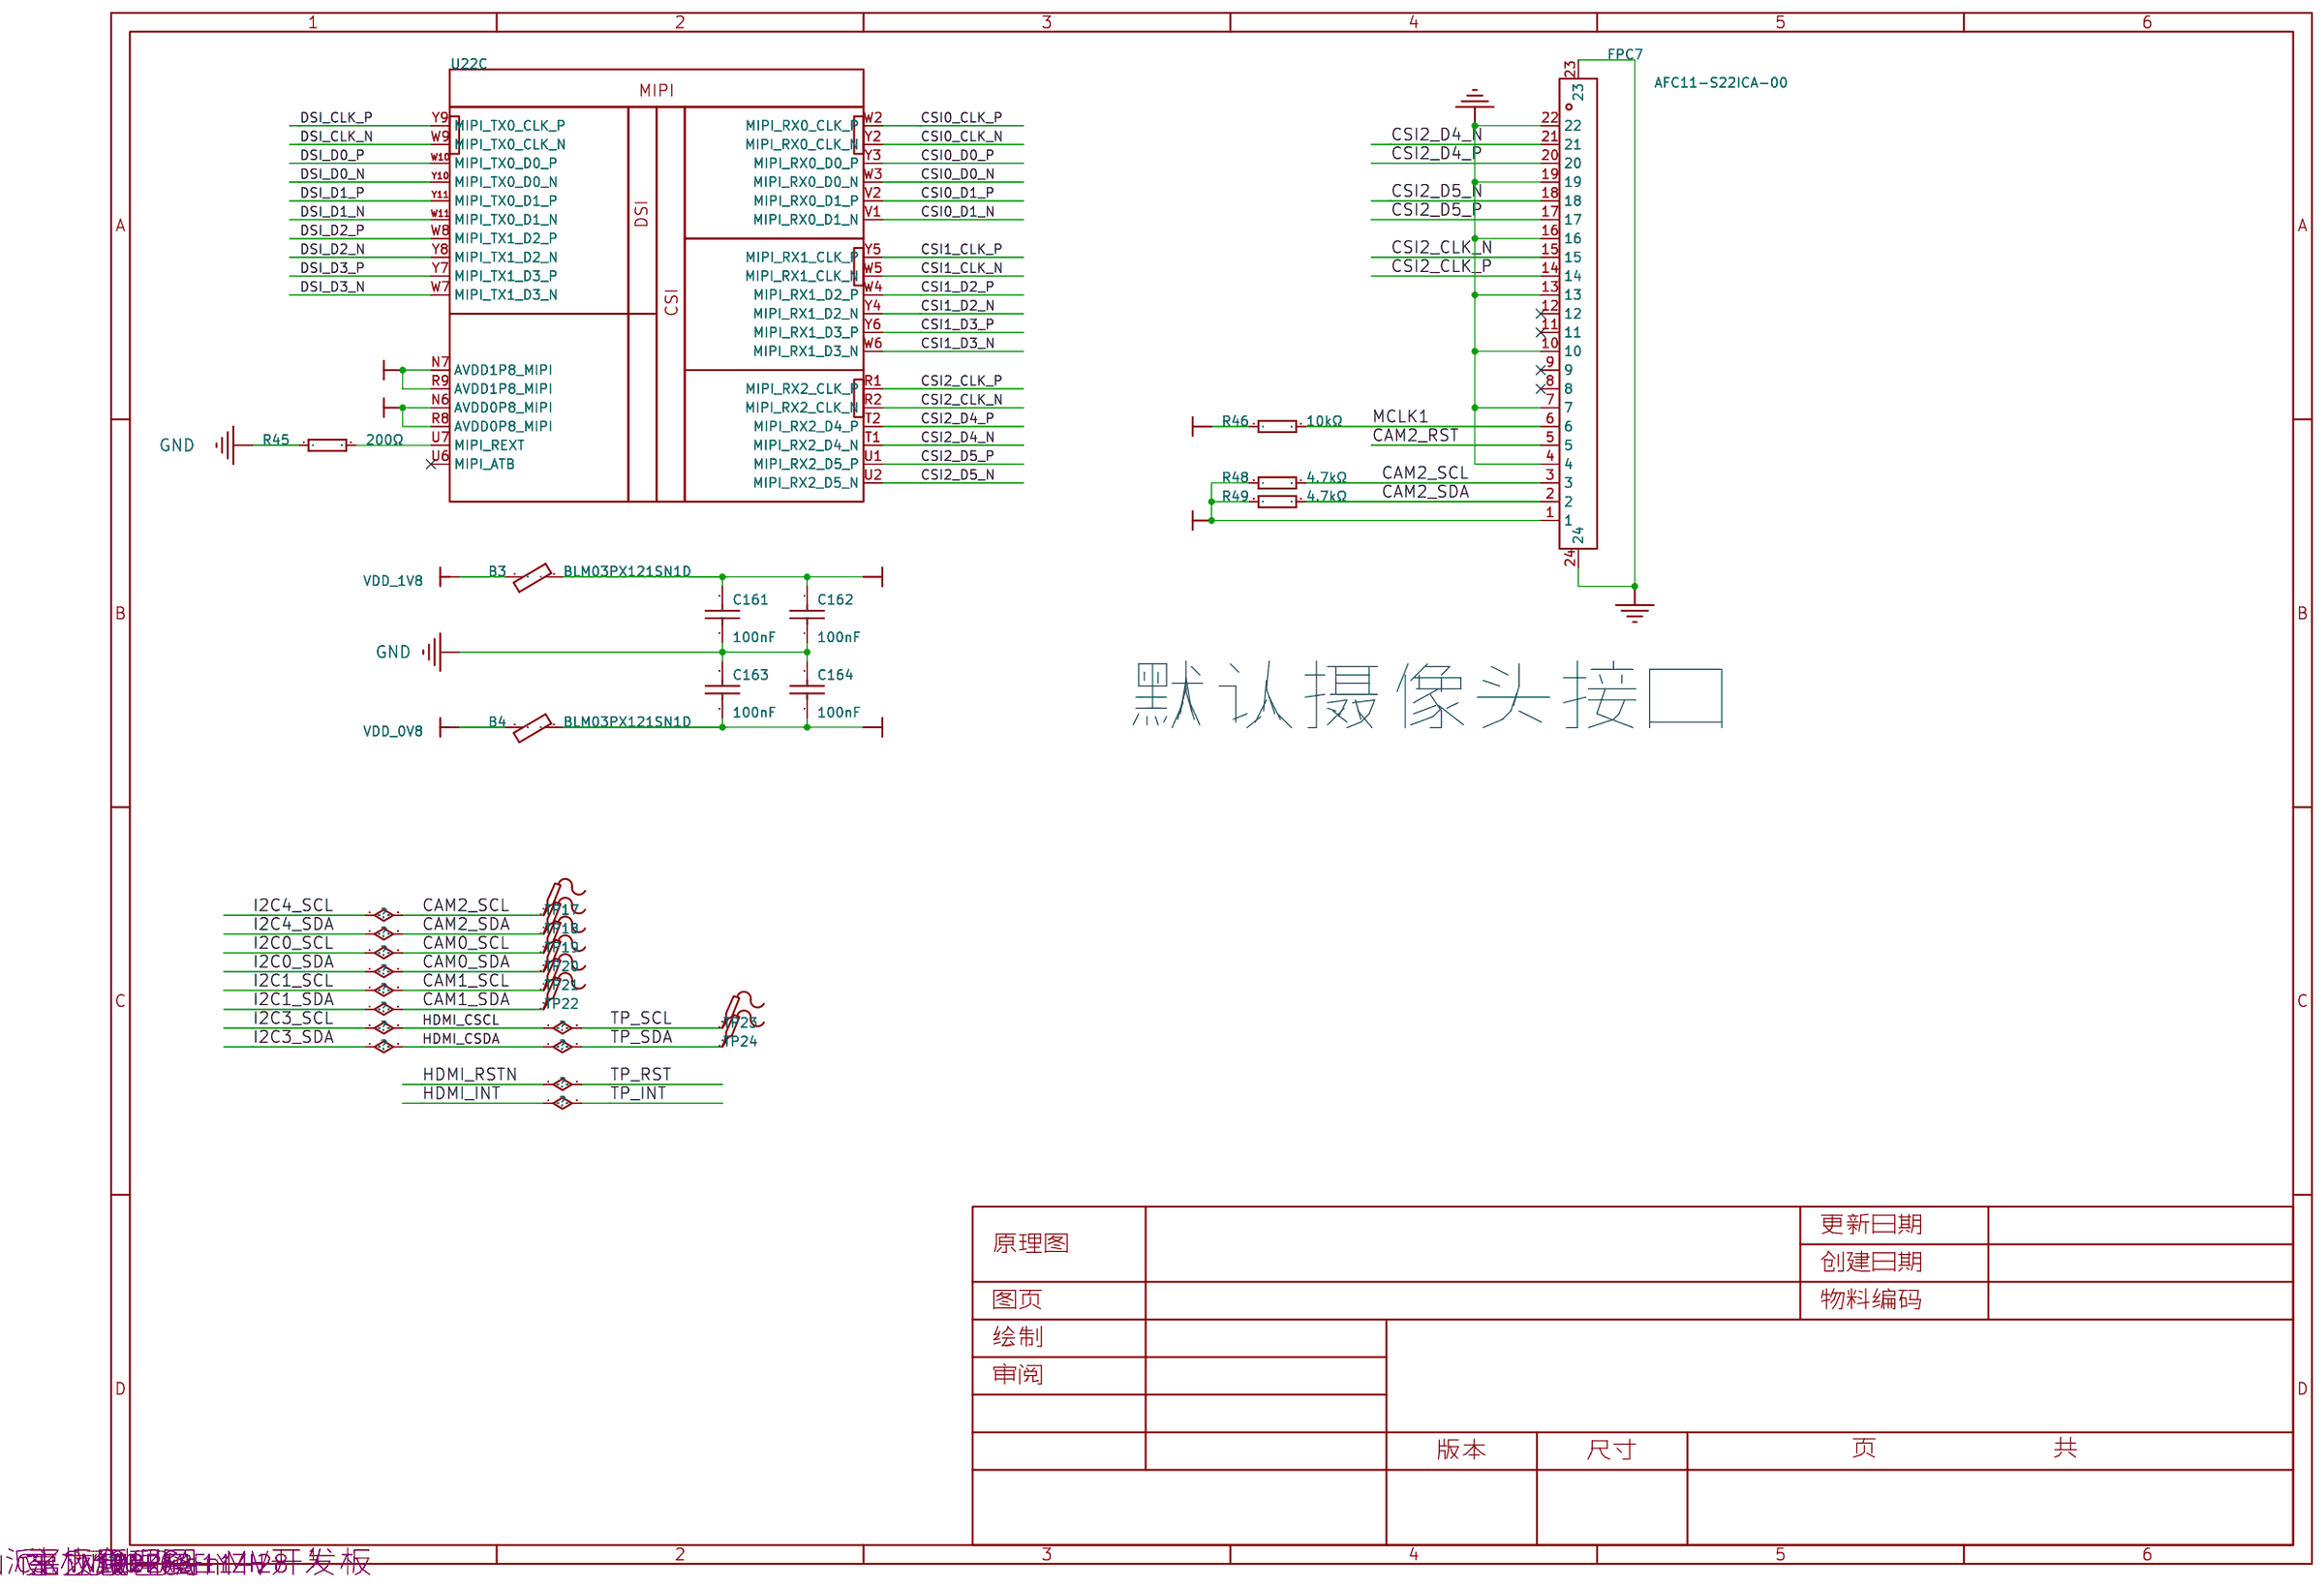
[diagram p9: CSI INTERFACE]

## Parts
sheet CSI INTERFACE
B3  BLM03PX121SN1D  [R0201_1]
B4  BLM03PX121SN1D  [R0201_1]
C161  100nF  [R0201]
C162  100nF  [R0201]
C163  100nF  [R0201]
C164  100nF  [R0201]
FPC7  AFC11-S22ICA-00  [FPC-SMD_22P-P1.00_AFC11-S22ICC-00]
R45  200Ω  [R0402]
R46  10kΩ  [R0402]
R48  4.7kΩ  [R0402]
R49  4.7kΩ  [R0402]
TP17  -  [Test-Point-0.5mm]
TP18  -  [Test-Point-0.5mm]
TP19  -  [Test-Point-0.5mm]
TP20  -  [Test-Point-0.5mm]
TP21  -  [Test-Point-0.5mm]
TP22  -  [Test-Point-0.5mm]
TP23  -  [Test-Point-0.5mm]
TP24  -  [Test-Point-0.5mm]
sheet DBG AUDIO KEY LED
CN2  GH125-S04DCA-00  [CONN-SMD_4P-P1.27_GH125-S04DCA-00]
CN3  GH125-S04DCA-00  [CONN-SMD_4P-P1.27_GH125-S04DCA-00]
D5  KLXES15AAA1  [R0402_1]
D6  KLXES15AAA1  [R0402_1]
D7  KLXES15AAA1  [R0402_1]
D8  KLXES15AAA1  [R0402_1]
LED2  NCD0402R1  [LED0402-RD]
R70  0402WGF1000TCE  [R0402_1]
R71  0402WGF1000TCE  [R0402_1]
R73  2kΩ  [R0402_3]
R76  0402WGF1000TCE  [R0402_1]
R77  0402WGF1000TCE  [R0402_1]
SW1  TSA016A2518C  [SW-SMD_4P-L4.2-W3.3-P2.15-LS4.6]
SW2  TSA016A2518C  [SW-SMD_4P-L4.2-W3.3-P2.15-LS4.6]
sheet K230 BOOT
C41  27pF  [R0402]
C42  27pF  [R0402]
C43  20pF  [R0402]
C44  20pF  [R0402]
C45  100nF  [R0402]
C46  100nF  [R0402]
C47  100nF  [R0201]
C48  100nF  [R0201]
C50  4.7uF  [R0402]
C51  100nF  [R0201]
R25  NC  [R0402]
R26  10kΩ/NC  [R0201]
R27  10kΩ  [R0402]
R28  30kΩ  [R0201]
R29  30kΩ  [R0201]
R30  200Ω  [R0201]
R31  200Ω  [R0201]
R32  100kΩ  [R0402]
R33  10kΩ  [R0402]
R34  10kΩ  [R0402]
R35  10kΩ  [R0402]
R36  0Ω  [R0402]
R37  NC  [R0402]
R38  NC  [R0402]
TP14  RSTN  [Test-Point-0.5mm]
TP15  BOOT0  [Test-Point-0.5mm]
TP16  BOOT1  [Test-Point-0.5mm]
U22  K230  [K230]  (sections 1,2,3,4,5)
Y1  32.768kHz  [OSC-SMD_L3.2-W1.5]
Y2  24MHz  [XTAL_3225]
sheet K230 GPIO
C52  100nF  [R0201]
C53  100nF  [R0201]
C54  100nF  [R0201]
C55  100nF  [R0201]
C56  100nF  [R0201]
C57  100nF  [R0201]
H1  -  [HDR-TH_3P-P2.54-V-M]
sheet LPDDR4
C98  100nF  [R0402]
C99  100nF  [R0402]
C100  100nF  [R0201]
R39  0Ω  [R0402]
R40  240Ω  [R0201]
R41  0Ω  [R0402]
R42  240Ω  [R0402]
R43  1kΩ  [R0402]
R44  1kΩ  [R0402]
U23  K4F8E304HB-MGCJ  [BGA-200_L15.0-W10.0_K4F8E304HB-MGCJ]  (sections A,B)
sheet Power SUPPLY 8-24V
C7  10uF  [C1206]
C8  100nF  [R0603]
C9  100nF  [R0603]
C10  22uF  [R0603]
C11  22uF  [R0603]
C12  75pF  [R0402]
D3  SMAJ24A  [SMA_L4.3-W2.7-LS5.1-RD]
F1  BSMD1812-200-30V  [F1812]
L1  10uH  [IND-SMD_L5.4-W5.2_FXL0530]
R7  511kΩ  [R0402]
R8  49.9Ω  [R0402]
R9  105kΩ  [R0402]
R10  100kΩ  [R0402_1]
R11  13.3kΩ  [R0402]
TP6  -  [Test-Point-0.5mm_1]
TP7  8V-24V_IN+  [Test-Point-0.5mm]
TP25  -  [Test-Point-0.5mm_1]
U6  TPS54302DDCR  [SOT-23-6_L2.9-W1.6-P0.95-LS2.8-BL]
sheet Power SUPPLY USB AND PIN
C1  10uF  [R0603]
C2  10uF  [R0603]
D1  BST236A054U  [SOT-23-6_L2.9-W1.6-P0.95-LS2.8-BR]
R1  3.4kΩ  [R0402]
R2  5.1kΩ  [R0402_3]
R3  5.1kΩ  [R0402_3]
TP1  USB0_N  [Test-Point-0.5mm]
TP2  USB5V_IN+  [Test-Point-0.5mm]
TP3  PRE_VDD_5V  [Test-Point-0.5mm]
TP4  GND  [Test-Point-0.5mm]
TP5  USB0_P  [Test-Point-0.5mm]
U1  USB-TYPE-C-019  [TYPE-C-SMD_HX-TYPE-C-16PIN]
U2  MT9700  [SOT-23-5_L3.0-W1.7-P0.95-LS2.8-BR]
sheet Screw Holes
SCREW1  -  [M3螺丝]
SCREW2  -  [M3螺丝]
SCREW3  -  [M3螺丝]
SCREW4  -  [M3螺丝]
sheet TF CARD OR SDNAND
C190  10uF  [R0402]
C191  100nF  [R0402]
CARD1  XKTF-015-G  [TF-SMD_XKTF-015-N]
R82  10kΩ  [R0402]
R83  10kΩ  [R0402]
R84  10kΩ  [R0402]
R85  10kΩ  [R0402]
R86  10kΩ  [R0402]
TP27  -  [Test-Point-0.5mm]
TP28  -  [Test-Point-0.5mm]
TP29  -  [Test-Point-0.5mm]
TP30  -  [Test-Point-0.5mm]
TP31  -  [Test-Point-0.5mm]
TP32  -  [Test-Point-0.5mm]

## Library data of the parts
B3 B4 = BLM03PX121SN1D: 标称阻抗@测试频率:120Ω@100MHz;误差:±25%;直流电阻(RDC):160mΩ;; LCSC Part Name: 单路 0201磁珠 阻抗120Ω@100MHz; Supplier Part: C525479; Manufacturer: muRata(村田); Supplier Footprint: 0201; JLCPCB Part Class: Extended Part; Datasheet: https://atta.szlcsc.com/upload/public/pdf/source/20200424/C521135_3D661A3521BD96777A1D2DEE005F5276.pdf; Supplier: LCSC; Impedance @ Frequency: 120Ω@100MHz; Tolerance: ±25%; DC Resistance: 160mΩ; Current Rating: 700mA; Circuits: 1; Check: false
C47 C48 C52-C57 C100 C161-C164 = GRM033R61A104KE15D: 容值:100nF;精度:±10%;额定电压:10V;材质(温度系数):X5R;; LCSC Part Name: 100nF ±10% 10V; Supplier Part: C76934; Manufacturer: muRata(村田); Supplier Footprint: 0201; JLCPCB Part Class: Extended Part; Datasheet: https://atta.szlcsc.com/upload/public/pdf/source/20180307/C76934_15204090982891407723.pdf; Supplier: LCSC; Tolerance: ±10%; Voltage Rated: 10V; Temperature Coefficient: X5R
FPC7 = AFC11-S22ICA-00: 锁定特性:抽屉式;触点类型:单侧触点/垂直;触点数量:22P;间距:0.5mm;安装类型:立贴;; LCSC Part Name: 间距:0.5mm P数:22P 抽屉式 单侧触点/垂直; Supplier Part: C5248019; Manufacturer: JS(钜硕电子); Supplier Footprint: SMD,P=0.5mm; JLCPCB Part Class: Extended Part; Datasheet: https://atta.szlcsc.com/upload/public/pdf/source/20191211/C466537_F6F2472ADACFFA77E875AFE9DAB8E0AD.pdf; Supplier: LCSC; Locking Feature: 抽屉式; Contact Type: 单侧触点/垂直; Number of Contacts: 22P; Pitch: 0.5mm; Mounting Type: 立贴; Height Above Board: 5.65mm
R45 = 0402WGF2000TCE: 电阻类型:厚膜电阻;阻值:200Ω;精度:±1%;功率:62.5mW;最大工作电压:50V;温度系数:±100ppm/℃;; LCSC Part Name: 200Ω ±1% 62.5mW 厚膜电阻; Supplier Part: C25087; Manufacturer: UNI-ROYAL(厚声); Supplier Footprint: 0402; JLCPCB Part Class: Basic Part; Datasheet: https://atta.szlcsc.com/upload/public/pdf/source/20200306/C422600_1E6D84923E4A46A82E41ADD87F860B5C.pdf; Supplier: LCSC; Type: 厚膜电阻; Tolerance: ±1%; Power(Watts): 62.5mW; Overload Voltage (Max): 50V; Temperature Coefficient: ±100ppm/℃; Operating Temperature Range: -55℃~+155℃; Check: false
R27 R33-R35 R46 = 0402WGF1002TCE: 电阻类型:厚膜电阻;阻值:10kΩ;精度:±1%;功率:62.5mW;最大工作电压:50V;温度系数:±100ppm/℃;; LCSC Part Name: 10kΩ ±1% 62.5mW 厚膜电阻; Supplier Part: C25744; Manufacturer: UNI-ROYAL(厚声); Supplier Footprint: 0402; JLCPCB Part Class: 基础库; Datasheet: https://atta.szlcsc.com/upload/public/pdf/source/20200306/C422600_1E6D84923E4A46A82E41ADD87F860B5C.pdf; Supplier: LCSC; Type: 厚膜电阻; Tolerance: ±1%; Power(Watts): 62.5mW; Overload Voltage (Max): 50V; Temperature Coefficient: ±100ppm/℃; Operating Temperature Range: -55℃~+155℃; Check: false
R48 R49 = 0402WGF4701TCE: 电阻类型:厚膜电阻;阻值:4.7kΩ;精度:±1%;功率:62.5mW;最大工作电压:50V;温度系数:±100ppm/℃;; LCSC Part Name: 4.7kΩ ±1% 62.5mW 厚膜电阻; Supplier Part: C25900; Manufacturer: UNI-ROYAL(厚声); Supplier Footprint: 0402; JLCPCB Part Class: Basic Part; Datasheet: https://atta.szlcsc.com/upload/public/pdf/source/20200306/C422600_1E6D84923E4A46A82E41ADD87F860B5C.pdf; Supplier: LCSC; Type: 厚膜电阻; Tolerance: ±1%; Power(Watts): 62.5mW; Overload Voltage (Max): 50V; Temperature Coefficient: ±100ppm/℃; Operating Temperature Range: -55℃~+155℃; Check: false
TP1-TP5 TP7 TP14-TP24 TP27-TP32 = Test-Point: Test Point 测试点
CN2 CN3 = GH125-S04DCA-00: 参考系列:-;间距:1.25mm;插针结构:1x4P;排数:1;每排PIN数:4;行距:-;公母:公型插针;安装方式:卧贴;额定电流:1A;工作温度范围:-25℃~+85℃;; LCSC Part Name: GH1.25卧式贴片 带扣; Supplier Part: C2886767; Manufacturer: JS(钜硕电子); Supplier Footprint: SMD,P=1.25mm; JLCPCB Part Class: 扩展库; Datasheet: https://atta.szlcsc.com/upload/public/pdf/source/20210818/CD11791E5ED3EDF45A7009E9C8A2BD4C.pdf; Supplier: LCSC; Pitch: 1.25mm; Pins Structure: 1x4P; Number of Rows: 1; Number of PINs Per Row: 4; Gender: 公型插针; Mounting Style: 卧贴; Current Rating (Max): 1A; Operating Temperature Range: -25℃~+85℃
D5-D8 = KLXES15AAA1: 极性:双向;反向截止电压(Vrwm):5V;钳位电压(Vc)@Ipp:40V;; Supplier Part: C2892490; Manufacturer: KUU; Supplier Footprint: 0402; JLCPCB Part Class: Extended Part; Datasheet: https://atta.szlcsc.com/upload/public/pdf/source/20210908/40FD94D5521B4EF0ED53BC030E77ED53.pdf; Supplier: LCSC; Polarity: 双向; Reverse Stand-Off Voltage (Vrwm): 5V; Clamping Voltage@Ipp: 40V; Check: false
LED2 = NCD0402R1: 发光颜色:红灯;; Supplier Part: C130719; Manufacturer: 国星光电; Supplier Footprint: 0402; JLCPCB Part Class: 扩展库; Datasheet: https://atta.szlcsc.com/upload/public/pdf/source/20200820/C130719_A72EA5A7FEC83C35856EA0453E4EE775.pdf; Supplier: LCSC; Emitted Color: 红灯
R70 R71 R76 R77 = 0402WGF1000TCE: Supplier: LCSC; Supplier Part: C25076; Supplier Footprint: 0402; JLCPCB Part Class: Basic Part; LCSC Part Name: 100Ω(1000) ±1% 编带; Datasheet: https://atta.szlcsc.com/upload/public/pdf/source/20170920/C25076_1505901197574982707.pdf; Manufacturer: UNI-ROYAL(厚声)
R73 = 0402WGF2001TCE: 电阻类型:厚膜电阻;阻值:2kΩ;精度:±1%;功率:62.5mW;; LCSC Part Name: 2kΩ ±1% 62.5mW; Supplier Part: C4109; Manufacturer: UNI-ROYAL(厚声); Supplier Footprint: 0402; JLCPCB Part Class: 基础库; Datasheet: https://atta.szlcsc.com/upload/public/pdf/source/20200306/C422600_1E6D84923E4A46A82E41ADD87F860B5C.pdf; Supplier: LCSC; Type: 厚膜电阻; Tolerance: ±1%; Power(Watts): 62.5mW; Temperature Coefficient: ±100ppm/℃; Overload Voltage (Max): 50V; Operating Temperature Range: -55℃~+155℃
SW1 SW2 = TSA016A2518C: 按钮形状:椭圆形按钮;作用力:180gf;安装方式:立贴;开关长度:4.2mm;开关宽度:3.35mm;开关高度:2.5mm;触点电流:50mA;额定电压(AC):-;额定电压(DC):12V;机械寿命:-;; LCSC Part Name: 4.2*3.35*2.5mm 立贴 轻触开关; Supplier Part: C2888430; Manufacturer: BZCN(博众电气); Supplier Footprint: SMD; JLCPCB Part Class: 扩展库; Datasheet: https://atta.szlcsc.com/upload/public/pdf/source/20210906/0198B859780D4FA617E4EB862D7350E5.pdf; Supplier: LCSC; Actuator Style: 椭圆形按钮; Operating Force: 180gf; Mounting Style: 立贴; Switch Length: 4.2mm; Switch Width: 3.35mm; Switch Height: 2.5mm; Contact Current: 50mA; Voltage Rating (DC): 12V; Actuator/Cap Color: 白色
C41 C42 = CC0402JRNPO9BN270: 容值:27pF;精度:±5%;额定电压:50V;材质(温度系数):NP0;; LCSC Part Name: 27pF ±5% 50V; Supplier Part: C107002; Manufacturer: YAGEO(国巨); Supplier Footprint: 0402; JLCPCB Part Class: Extended Part; Datasheet: https://atta.szlcsc.com/upload/public/pdf/source/20170914/C128857_1505359892143968080.pdf; Supplier: LCSC; Tolerance: ±5%; Voltage Rated: 50V; Temperature Coefficient: NP0
C43 C44 = CC0402JRNPO9BN200: 容值:20pF;精度:±5%;额定电压:50V;材质(温度系数):NP0;; LCSC Part Name: 20pF ±5% 50V; Supplier Part: C107000; Manufacturer: YAGEO(国巨); Supplier Footprint: 0402; JLCPCB Part Class: Extended Part; Datasheet: https://atta.szlcsc.com/upload/public/pdf/source/20170914/C128857_1505359892143968080.pdf; Supplier: LCSC; Tolerance: ±5%; Voltage Rated: 50V; Temperature Coefficient: NP0
C45 C191 = CC0402KRX7R7BB104: 容值:100nF;精度:±10%;额定电压:16V;材质(温度系数):X7R;; LCSC Part Name: 100nF ±10% 16V; Supplier Part: C60474; Manufacturer: YAGEO(国巨); Supplier Footprint: 0402; Datasheet: https://atta.szlcsc.com/upload/public/pdf/source/20211223/9278FD768280B81DDBEF48FA36411A03.pdf; Supplier: LCSC; Tolerance: ±10%; Voltage Rated: 16V; Temperature Coefficient: X7R
C46 C98 C99 = CL05B104KO5NNNC: 容值:100nF;精度:±10%;额定电压:16V;材质(温度系数):X7R;; LCSC Part Name: 100nF ±10% 16V; Supplier Part: C1525; Manufacturer: SAMSUNG(三星); Supplier Footprint: 0402; JLCPCB Part Class: Basic Part; Datasheet: https://atta.szlcsc.com/upload/public/pdf/source/20160218/1457707763339.pdf; Supplier: LCSC; Tolerance: ±10%; Voltage Rated: 16V; Temperature Coefficient: X7R; Check: false
C50 = CL05A475MP5NRNC: 容值:4.7uF;精度:±20%;额定电压:10V;材质(温度系数):X5R;; LCSC Part Name: 4.7uF ±20% 10V; Supplier Part: C23733; Manufacturer: SAMSUNG(三星); Supplier Footprint: 0402; JLCPCB Part Class: Basic Part; Datasheet: https://atta.szlcsc.com/upload/public/pdf/source/20160218/1457707763339.pdf; Supplier: LCSC; Tolerance: ±20%; Voltage Rated: 10V; Temperature Coefficient: X5R; Check: false
C51 = CL03A104KO3NNNC: 容值:100nF;精度:±10%;额定电压:16V;材质(温度系数):X5R;; LCSC Part Name: 100nF ±10% 16V; Supplier Part: C307380; Manufacturer: SAMSUNG(三星); Supplier Footprint: 0201; JLCPCB Part Class: Extended Part; Datasheet: https://atta.szlcsc.com/upload/public/pdf/source/20160218/1457707763339.pdf; Supplier: LCSC; Tolerance: ±10%; Voltage Rated: 16V; Temperature Coefficient: X5R; Check: false
R25 R37 R38 = RES
R26 = 0201WMF1002TEE: 电阻类型:厚膜电阻;阻值:10kΩ;精度:±1%;功率:50mW;最大工作电压:25V;温度系数:±200ppm/℃;; LCSC Part Name: 10kΩ ±1% 50mW 厚膜电阻; Supplier Part: C473048; Manufacturer: UNI-ROYAL(厚声); Supplier Footprint: 0201; JLCPCB Part Class: Extended Part; Datasheet: https://atta.szlcsc.com/upload/public/pdf/source/20200306/C422600_1E6D84923E4A46A82E41ADD87F860B5C.pdf; Supplier: LCSC; Type: 厚膜电阻; Tolerance: ±1%; Power(Watts): 50mW; Overload Voltage (Max): 25V; Temperature Coefficient: ±200ppm/℃; Operating Temperature Range: -55℃~+155℃; Check: false
R28 R29 = RC0201FR-0730KL: 电阻类型:厚膜电阻;阻值:30kΩ;精度:±1%;功率:50mW;最大工作电压:25V;温度系数:±200ppm/℃;; LCSC Part Name: 厚膜电阻 30kΩ ±1% 50mW; Supplier Part: C138153; Manufacturer: YAGEO(国巨); Supplier Footprint: 0201; JLCPCB Part Class: Extended Part; Datasheet: https://atta.szlcsc.com/upload/public/pdf/source/20181009/C309620_DA5935B6E1D48212CB7A533FE518B3C2.pdf; Supplier: LCSC; Type: 厚膜电阻; Tolerance: ±1%; Power(Watts): 50mW; Overload Voltage (Max): 25V; Temperature Coefficient: ±200ppm/℃; Operating Temperature Range: -55℃~+125℃; Check: false
R30 R31 = 0201WMF2000TEE: 电阻类型:厚膜电阻;阻值:200Ω;精度:±1%;功率:50mW;最大工作电压:25V;温度系数:±200ppm/℃;; LCSC Part Name: 200Ω ±1% 50mW 厚膜电阻; Supplier Part: C270359; Manufacturer: UNI-ROYAL(厚声); Supplier Footprint: 0201; JLCPCB Part Class: Extended Part; Datasheet: https://atta.szlcsc.com/upload/public/pdf/source/20200306/C422600_1E6D84923E4A46A82E41ADD87F860B5C.pdf; Supplier: LCSC; Type: 厚膜电阻; Tolerance: ±1%; Power(Watts): 50mW; Overload Voltage (Max): 25V; Temperature Coefficient: ±200ppm/℃; Operating Temperature Range: -55℃~+155℃; Check: false
R32 = 0402WGF1003TCE: 电阻类型:厚膜电阻;阻值:100kΩ;精度:±1%;功率:62.5mW;最大工作电压:50V;温度系数:±100ppm/℃;; LCSC Part Name: 100kΩ ±1% 62.5mW; Supplier Part: C25741; Manufacturer: UNI-ROYAL(厚声); Supplier Footprint: 0402; JLCPCB Part Class: Basic Part; Datasheet: https://atta.szlcsc.com/upload/public/pdf/source/20200306/C422600_1E6D84923E4A46A82E41ADD87F860B5C.pdf; Supplier: LCSC; Type: 厚膜电阻; Tolerance: ±1%; Power(Watts): 62.5mW; Temperature Coefficient: ±100ppm/℃; Overload Voltage (Max): 50V; Operating Temperature Range: -55℃~+155℃; Check: false
R36 R39 R41 = 0402WGF0000TCE: 电阻类型:厚膜电阻;阻值:0Ω;精度:±1%;功率:62.5mW;最大工作电压:50V;温度系数:±800ppm/℃;; LCSC Part Name: 0Ω ±1% 62.5mW 厚膜电阻; Supplier Part: C17168; Manufacturer: UNI-ROYAL(厚声); Supplier Footprint: 0402; JLCPCB Part Class: Basic Part; Datasheet: https://atta.szlcsc.com/upload/public/pdf/source/20200306/C422600_1E6D84923E4A46A82E41ADD87F860B5C.pdf; Supplier: LCSC; Type: 厚膜电阻; Tolerance: ±1%; Power(Watts): 62.5mW; Overload Voltage (Max): 50V; Temperature Coefficient: ±800ppm/℃; Operating Temperature Range: -55℃~+155℃; Check: false
U22 = K230: Supplier Part: C21264502; Manufacturer: Canaan(嘉楠); Supplier Footprint: BGA-390(13x13); JLCPCB Part Class: Extended Part; Datasheet: https://atta.szlcsc.com/upload/public/pdf/source/20240304/CED0BDC8B8BEDC72BFC23F1C8A2ED83A.pdf; Supplier: LCSC; Check: false
Y1 = X321532768KGD2SI: 晶振类型:贴片晶振;频率:32.768kHz;常温频差:±20ppm;外接负载电容:12.5pF;频率稳定度(全温):-;; LCSC Part Name: 32.768kHz ±20ppm 12.5pF; Supplier Part: C620155; Manufacturer: YXC(扬兴晶振); Supplier Footprint: SMD3215-2P; JLCPCB Part Class: Extended Part; Datasheet: https://atta.szlcsc.com/upload/public/pdf/source/20240329/3A7650FD985DD0DE85694D3785AB4916.pdf; Supplier: LCSC; Crystal Type: 贴片晶振; Normal temperature Frequency Tolerance: ±20ppm; External load capacitor: 12.5pF; Operating Temperature: -40℃~+85℃; Part Number: *
Y2 = X322524MOB4SI: 晶振类型:贴片晶振;频率:24MHz;常温频差:±10ppm;外接负载电容:12pF;频率稳定度(全温):±20ppm;; LCSC Part Name: 24MHz ±10ppm 12pF; Supplier Part: C70590; Manufacturer: YXC(扬兴晶振); Supplier Footprint: SMD3225-4P; JLCPCB Part Class: Extended Part; Datasheet: https://atta.szlcsc.com/upload/public/pdf/source/20240329/19D5F850207469550BEB00D7DFEDBC7A.pdf; Supplier: LCSC; Crystal Type: 贴片晶振; Normal temperature Frequency Tolerance: ±10ppm; External load capacitor: 12pF; Frequency Stability(Full temperature range): ±20ppm; Operating Temperature: -40℃~+85℃; Check: false
H1 = HDR-M_2.54_1x3P: Supplier Part: C2937625; Supplier Footprint: 插件
R40 = RC0201FR-07240RL: 电阻类型:厚膜电阻;阻值:240Ω;精度:±1%;功率:50mW;最大工作电压:25V;温度系数:±200ppm/℃;; LCSC Part Name: 厚膜电阻 240Ω ±1% 50mW; Supplier Part: C155745; Manufacturer: YAGEO(国巨); Supplier Footprint: 0201; JLCPCB Part Class: Extended Part; Datasheet: https://atta.szlcsc.com/upload/public/pdf/source/20181009/C309620_DA5935B6E1D48212CB7A533FE518B3C2.pdf; Supplier: LCSC; Type: 厚膜电阻; Tolerance: ±1%; Power(Watts): 50mW; Overload Voltage (Max): 25V; Temperature Coefficient: ±200ppm/℃; Operating Temperature Range: -55℃~+125℃; Check: false
R42 = 0402WGF2400TCE: 电阻类型:厚膜电阻;阻值:240Ω;精度:±1%;功率:62.5mW;最大工作电压:50V;温度系数:±100ppm/℃;; LCSC Part Name: 240Ω ±1% 62.5mW 厚膜电阻; Supplier Part: C25094; Manufacturer: UNI-ROYAL(厚声); Supplier Footprint: 0402; JLCPCB Part Class: Extended Part; Datasheet: https://atta.szlcsc.com/upload/public/pdf/source/20200306/C422600_1E6D84923E4A46A82E41ADD87F860B5C.pdf; Supplier: LCSC; Type: 厚膜电阻; Tolerance: ±1%; Power(Watts): 62.5mW; Overload Voltage (Max): 50V; Temperature Coefficient: ±100ppm/℃; Operating Temperature Range: -55℃~+155℃; Check: false
R43 R44 = 0402WGF1001TCE: 电阻类型:厚膜电阻;阻值:1kΩ;精度:±1%;功率:62.5mW;最大工作电压:50V;温度系数:±100ppm/℃;; LCSC Part Name: 1kΩ ±1% 62.5mW 厚膜电阻; Supplier Part: C11702; Manufacturer: UNI-ROYAL(厚声); Supplier Footprint: 0402; JLCPCB Part Class: Basic Part; Datasheet: https://atta.szlcsc.com/upload/public/pdf/source/20200306/C422600_1E6D84923E4A46A82E41ADD87F860B5C.pdf; Supplier: LCSC; Type: 厚膜电阻; Tolerance: ±1%; Power(Watts): 62.5mW; Overload Voltage (Max): 50V; Temperature Coefficient: ±100ppm/℃; Operating Temperature Range: -55℃~+155℃; Check: false
U23 = K4F8E304HB-MGCJ: LPDDR4-x32; Supplier Part: C2803257; Supplier Footprint: TFBGA-200; JLCPCB Part Class: Extended Part; Supplier: LCSC; Check: false
C7 = CL31B106KBHNNNE: 容值:10uF;精度:±10%;额定电压:50V;材质(温度系数):X7R;; LCSC Part Name: 10uF ±10% 50V; Supplier Part: C89632; Manufacturer: SAMSUNG(三星); Supplier Footprint: 1206; Datasheet: https://atta.szlcsc.com/upload/public/pdf/source/20161130/1480498807789.pdf; Supplier: LCSC; Tolerance: ±10%; Voltage Rated: 50V; Temperature Coefficient: X7R
C8 C9 = CC0603KRX7R9BB104: 容值:100nF;精度:±10%;额定电压:50V;材质(温度系数):X7R;; LCSC Part Name: 100nF ±10% 50V; Supplier Part: C14663; Manufacturer: YAGEO(国巨); Supplier Footprint: 0603; JLCPCB Part Class: Basic Part; Datasheet: https://atta.szlcsc.com/upload/public/pdf/source/20170116/1484561234239.pdf; Supplier: LCSC; Tolerance: ±10%; Voltage Rated: 50V; Temperature Coefficient: X7R
C10 C11 = CL10A226MP8NUNE: 容值:22uF;精度:±20%;额定电压:10V;材质(温度系数):X5R;; LCSC Part Name: 22uF ±20% 10V; Supplier Part: C86295; Manufacturer: SAMSUNG(三星); Supplier Footprint: 0603; JLCPCB Part Class: 扩展库; Datasheet: https://atta.szlcsc.com/upload/public/pdf/source/20160218/1457707763339.pdf; Supplier: LCSC; Tolerance: ±20%; Voltage Rated: 10V; Temperature Coefficient: X5R
C12 = CC0402JRNPO9BN750: 容值:75pF;精度:±5%;额定电压:50V;材质(温度系数):NP0;; LCSC Part Name: 75pF ±5% 50V; Supplier Part: C107010; Manufacturer: YAGEO(国巨); Supplier Footprint: 0402; JLCPCB Part Class: 扩展库; Datasheet: https://atta.szlcsc.com/upload/public/pdf/source/20170914/C128857_1505359892143968080.pdf; Supplier: LCSC; Tolerance: ±5%; Voltage Rated: 50V; Temperature Coefficient: NP0
D3 = SMAJ24A_C908774: 反向截止电压(Vrwm):24V;最大钳位电压:38.9V;峰值脉冲电流(Ipp)@10/1000us:10.3A;击穿电压:26.7V;; LCSC Part Name: 单向TVS 24V截止 10.3A峰值脉冲; Supplier Part: C908774; Manufacturer: GOODWORK(固得沃克); Supplier Footprint: SMA(DO-214AC); JLCPCB Part Class: 扩展库; Datasheet: https://atta.szlcsc.com/upload/public/pdf/source/20201231/C908757_5436EAF671B686EFC2F0DD2098F0ED89.pdf; Supplier: LCSC; Reverse Stand-Off Voltage (Vrwm): 24V; Maximum Clamping Voltage: 38.9V; Peak Pulse Current (Ipp)@10/1000us: 10.3A; Breakdown Voltage: 26.7V; Reverse Leakage Current (Ir): 5uA; Type: TVS
F1 = BSMD1812-200-30V: 最大电压:30V;最大电流:40A;保持电流:2A;跳闸电流:4A;; LCSC Part Name: 30V 2A 1812自恢复; Supplier Part: C960026; Manufacturer: BHFUSE(佰宏); Supplier Footprint: 1812; JLCPCB Part Class: 扩展库; Datasheet: https://atta.szlcsc.com/upload/public/pdf/source/20230512/6ED7FF50F668B3AF958C55F12246A840.pdf; Supplier: LCSC; Operating Voltage (Max): 30V; Current Rating (Max): 40A; Hold Current: 2A; Trip Current: 4A; Power Dissipation: 1W; Resistance - Initial (Ri) (Min): 20mΩ; Resistance - Post Trip (R1) (Max): 100mΩ; Maximum Time to Trip: 2s; Operating Temperature: -40℃~+85℃
L1 = FXL0530-100-M: 电感值:10uH;精度:±20%;额定电流:3.2A;饱和电流(Isat):3.5A;类型:一体成型电感;; LCSC Part Name: 10uH ±20% 3.5A; Supplier Part: C177248; Manufacturer: cjiang(长江微电); Supplier Footprint: SMD,5.2x5.4mm; Datasheet: https://atta.szlcsc.com/upload/public/pdf/source/20240426/3189EA8206330E2108542F9E34E540E7.pdf; Supplier: LCSC; Tolerance: ±20%; Rated Current: 3.2A; Saturation Current (Isat): 3.5A; DC Resistance (DCR): 125mΩ; Type: 一体成型电感
R7 = 0402WGF5113TCE: 电阻类型:厚膜电阻;阻值:511kΩ;精度:±1%;功率:62.5mW;最大工作电压:50V;温度系数:±100ppm/℃;; LCSC Part Name: 511kΩ ±1% 62.5mW 厚膜电阻; Supplier Part: C64042; Manufacturer: UNI-ROYAL(厚声); Supplier Footprint: 0402; JLCPCB Part Class: 扩展库; Datasheet: https://atta.szlcsc.com/upload/public/pdf/source/20200306/C422600_1E6D84923E4A46A82E41ADD87F860B5C.pdf; Supplier: LCSC; Type: 厚膜电阻; Tolerance: ±1%; Power(Watts): 62.5mW; Overload Voltage (Max): 50V; Temperature Coefficient: ±100ppm/℃; Operating Temperature Range: -55℃~+155℃
R8 = 0402WGF499JTCE: 电阻类型:厚膜电阻;阻值:49.9Ω;精度:±1%;功率:62.5mW;最大工作电压:50V;温度系数:±100ppm/℃;; LCSC Part Name: 49.9Ω ±1% 62.5mW 厚膜电阻; Supplier Part: C25120; Manufacturer: UNI-ROYAL(厚声); Supplier Footprint: 0402; JLCPCB Part Class: 基础库; Datasheet: https://atta.szlcsc.com/upload/public/pdf/source/20200306/C422600_1E6D84923E4A46A82E41ADD87F860B5C.pdf; Supplier: LCSC; Type: 厚膜电阻; Tolerance: ±1%; Power(Watts): 62.5mW; Overload Voltage (Max): 50V; Temperature Coefficient: ±100ppm/℃; Operating Temperature Range: -55℃~+155℃
R9 = 0402WGF1053TCE: 电阻类型:厚膜电阻;阻值:105kΩ;精度:±1%;功率:62.5mW;最大工作电压:50V;温度系数:±100ppm/℃;; LCSC Part Name: 105kΩ ±1% 62.5mW 厚膜电阻; Supplier Part: C25742; Manufacturer: UNI-ROYAL(厚声); Supplier Footprint: 0402; JLCPCB Part Class: 扩展库; Datasheet: https://atta.szlcsc.com/upload/public/pdf/source/20200306/C422600_1E6D84923E4A46A82E41ADD87F860B5C.pdf; Supplier: LCSC; Type: 厚膜电阻; Tolerance: ±1%; Power(Watts): 62.5mW; Overload Voltage (Max): 50V; Temperature Coefficient: ±100ppm/℃; Operating Temperature Range: -55℃~+155℃
R10 = 0402WGF1003TCE: 电阻类型:厚膜电阻;阻值:100kΩ;精度:±1%;功率:62.5mW;温度系数:±100ppm/℃;最大工作电压:50V;工作温度范围:-55℃~+155℃;; LCSC Part Name: 100kΩ ±1% 62.5mW; Supplier Part: C25741; Manufacturer: UNI-ROYAL(厚声); Supplier Footprint: 0402; JLCPCB Part Class: Basic Part; Datasheet: https://atta.szlcsc.com/upload/public/pdf/source/20200306/C422600_1E6D84923E4A46A82E41ADD87F860B5C.pdf; Supplier: LCSC; Type: 厚膜电阻; Tolerance: ±1%; Power(Watts): 62.5mW; Temperature Coefficient: ±100ppm/℃; Overload Voltage (Max): 50V; Operating Temperature Range: -55℃~+155℃
R11 = 0402WGF1332TCE: 电阻类型:厚膜电阻;阻值:13.3kΩ;精度:±1%;功率:62.5mW;最大工作电压:50V;温度系数:±100ppm/℃;; LCSC Part Name: 13.3kΩ ±1% 62.5mW 厚膜电阻; Supplier Part: C122547; Manufacturer: UNI-ROYAL(厚声); Supplier Footprint: 0402; JLCPCB Part Class: 扩展库; Datasheet: https://atta.szlcsc.com/upload/public/pdf/source/20200306/C422600_1E6D84923E4A46A82E41ADD87F860B5C.pdf; Supplier: LCSC; Type: 厚膜电阻; Tolerance: ±1%; Power(Watts): 62.5mW; Overload Voltage (Max): 50V; Temperature Coefficient: ±100ppm/℃; Operating Temperature Range: -55℃~+155℃
TP6 TP25 = Test-Point_1: Test Point 测试点
U6 = TPS54302DDCR: 功能类型:降压型;输出类型:可调;输入电压:4.5V~28V;输出电压:596mV~28V;输出电流(最大值):3A;; Supplier Part: C311983; Manufacturer: TI(德州仪器); Supplier Footprint: TSOT-23-6; JLCPCB Part Class: 扩展库; Datasheet: https://www.ti.com/cn/lit/gpn/tps54302; Supplier: LCSC; Function: 降压型; Output Type: 可调; Input Voltage: 4.5V~28V; Output Voltage: 596mV~28V; Output Current (Max): 3A; Switching Frequency: 400kHz; Operating Temperature: -40℃~+125℃@(TJ); Synchronous Rectification: 是; Number of Outputs: 1; Topology: 降压式; Switch tube (built-in/external): 内置
C1 C2 = CL10A106MA8NRNC: 容值:10uF;精度:±20%;额定电压:25V;材质(温度系数):X5R;; LCSC Part Name: 10uF ±20% 25V; Supplier Part: C96446; Manufacturer: SAMSUNG(三星); Supplier Footprint: 0603; Datasheet: https://atta.szlcsc.com/upload/public/pdf/source/20160218/1457707763339.pdf; Supplier: LCSC; Tolerance: ±20%; Voltage Rated: 25V; Temperature Coefficient: X5R
D1 = BST236A054U（自修改）: 反向关断电压（典型值）:5V;击穿电压（最小值）:6V;极性:-;箝位电压:13V;峰值脉冲电流（10/1000us）:3.5A (8/20us);; Supplier Part: C406203; Manufacturer: BORN(伯恩半导体); Supplier Footprint: SOT23-6; JLCPCB Part Class: 扩展库; Datasheet: https://atta.szlcsc.com/upload/public/pdf/source/20190723/C406203_BF93A0BD7D0538F0A550B5A01DEB1E59.pdf; Supplier: LCSC
R1 = 0402WGF3401TCE: 电阻类型:厚膜电阻;阻值:3.4kΩ;精度:±1%;功率:62.5mW;最大工作电压:50V;温度系数:±100ppm/℃;; LCSC Part Name: 3.4kΩ ±1% 62.5mW 厚膜电阻; Supplier Part: C4940; Manufacturer: UNI-ROYAL(厚声); Supplier Footprint: 0402; JLCPCB Part Class: 扩展库; Datasheet: https://atta.szlcsc.com/upload/public/pdf/source/20200306/C422600_1E6D84923E4A46A82E41ADD87F860B5C.pdf; Supplier: LCSC; Type: 厚膜电阻; Tolerance: ±1%; Power(Watts): 62.5mW; Overload Voltage (Max): 50V; Temperature Coefficient: ±100ppm/℃; Operating Temperature Range: -55℃~+155℃
R2 R3 = RC0402FR-075K1L: 电阻类型:厚膜电阻;阻值:5.1kΩ;精度:±1%;功率:62.5mW;; LCSC Part Name: 5.1kΩ ±1% 62.5mW; Supplier Part: C105872; Manufacturer: YAGEO(国巨); Supplier Footprint: 0402; JLCPCB Part Class: 扩展库; Datasheet: https://atta.szlcsc.com/upload/public/pdf/source/20170912/C105872_1505207464555963229.pdf; Supplier: LCSC; Type: 厚膜电阻; Tolerance: ±1%; Power(Watts): 62.5mW; Temperature Coefficient: ±100ppm/℃; Overload Voltage (Max): 50V; Operating Temperature Range: -55℃~+155℃
U1 = USB-TYPE-C-019（自修改）: 修改原理图封装; Supplier: LCSC; Supplier Part: C2927039; Manufacturer: DEALON(德艺隆); link: https://atta.szlcsc.com/upload/public/pdf/source/20211217/AE540A2D77B84677A3A029B8D0DDD2E1.pdf; JLCPCB Part Class: 扩展库; Supplier Footprint: 插件
U2 = MT9700: 低功耗负载开关/USB电源开关/限流保护开关; Supplier Part: C89855; Manufacturer: 西安航天民芯; Supplier Footprint: SOT-23-5; JLCPCB Part Class: 扩展库; Datasheet: https://atta.szlcsc.com/upload/public/pdf/source/20170418/1492481333031.pdf; Supplier: LCSC
SCREW1-SCREW4 = M3螺丝: Supplier Footprint: 插件
C190 = CL05A106MP5NUNC: 容值:10uF;精度:±20%;额定电压:10V;材质(温度系数):X5R;; LCSC Part Name: 10uF ±20% 10V; Supplier Part: C315248; Manufacturer: SAMSUNG(三星); Supplier Footprint: 0402; JLCPCB Part Class: Extended Part; Datasheet: https://atta.szlcsc.com/upload/public/pdf/source/20231220/1EF805BAE1520675928CC4638D279E74.pdf; Supplier: LCSC; Tolerance: ±20%; Voltage Rated: 10V; Temperature Coefficient: X5R
CARD1 = XKTF-015-G（自修改）: 卡连接方式:自弹式;卡类型:MicroSD卡(TF卡);连接器类型:卡座;本体最大高度:2mm;触头材质:铜合金;触头镀层:金;工作温度范围:-25℃~+90℃;焊接温度(最大值):260℃;; LCSC Part Name: 自弹式 MicroSD卡(TF卡) 卡座 双压 外焊 镀金; Supplier Part: C1121874; Manufacturer: XKB Connectivity(中国星坤); Supplier Footprint: SMD; JLCPCB Part Class: 扩展库; Datasheet: https://atta.szlcsc.com/upload/public/pdf/source/20211011/66E84C7106D817B4016DBCE6B64BEDA0.pdf; Supplier: LCSC; Card Connection Mode: 自弹式; Card Type: MicroSD卡(TF卡); Connector Type: 卡座; Maximum Body Height: 2mm; Contact Material: 铜合金; Contact Plating: 金; Operating Temperature Range: -25℃~+90℃; Welding Temperature (Max): 260℃
R82-R86 = 0402WGF1002TCE: 电阻类型:厚膜电阻;阻值:10kΩ;精度:±1%;功率:62.5mW;最大工作电压:50V;温度系数:±100ppm/℃;; LCSC Part Name: 10kΩ ±1% 62.5mW 厚膜电阻; Supplier Part: C25744; Manufacturer: UNI-ROYAL(厚声); Supplier Footprint: 0402; JLCPCB Part Class: 基础库; Datasheet: https://atta.szlcsc.com/upload/public/pdf/source/20200306/C422600_1E6D84923E4A46A82E41ADD87F860B5C.pdf; Supplier: LCSC; Type: 厚膜电阻; Tolerance: ±1%; Power(Watts): 62.5mW; Overload Voltage (Max): 50V; Temperature Coefficient: ±100ppm/℃; Operating Temperature Range: -55℃~+155℃

## Nets
8V-24V_IN+: F1.1 TP6.1 TP7.1
AGND: C45.1 R36.2 U22.G8(AVSS)
AVDD0P8_MIPI: B4.2 C163.2 C164.2 U22.N6(AVDD0P8_MIPI) U22.R8(AVDD0P8_MIPI)
AVDD1P8_MIPI: B3.2 C161.1 C162.1 U22.N7(AVDD1P8_MIPI) U22.R9(AVDD1P8_MIPI)
GND: C1.2 C2.2 C7.1 C8.1 C10.1 C11.1 C41.1 C42.1 C43.1 C44.1 C46.2 C47.2 C48.2 C50.2 C51.2 C52.2 C53.2 C54.2 C55.2 C56.2 C57.2 C99.2 C100.2 C161.2 C162.2 C163.1 C164.1 C190.2 C191.2 CARD1.6(VSS) CARD1.10(EP) CARD1.11(EP) CARD1.12(EP) CARD1.13(EP) CN2.1 CN2.4 CN2.5 CN2.6 CN3.4 CN3.5 CN3.6 D1.2(GND) D3.2(A) D5.1(K) D6.1(K) D7.1(K) D8.1(K) FPC7.4 FPC7.7 FPC7.10 FPC7.13 FPC7.16 FPC7.19 FPC7.22 FPC7.23 FPC7.24 H1.3 LED2.1(K) R1.2 R2.2 R3.2 R9.1 R11.1 R27.2 R30.2 R31.2 R36.1 R37.2 R38.2 R40.2 R44.2 R45.1 SW1.3 SW1.4 SW2.3 SW2.4 TP4.1 TP25.1 U1.1(GND) U1.2(GND) U1.3(GND) U1.4(GND) U1.A1B12(GND) U1.A12B1(GND) U2.2(GND) U6.1(GND) U22.A9(TEST_EN) U22.G7(AVSS) Y2.2 Y2.4 ; also on sheet 11 12 13
VDD0V8_CORE: B4.1 ; also on sheet 11 12
VDD_1V1: C98.1 R39.2 R41.2 R42.2 R43.1 ; also on sheet 11 12 13
VDD_1V8: B3.1 C47.1 C48.1 R32.1 R33.1 R34.1 U22.F7(AVDD1P8_CODEC) ; also on sheet 11 12 13
VDD_3V3: C52.1 C53.1 C54.1 C55.1 C56.1 C57.1 C190.1 C191.1 CARD1.4(VDD) FPC7.1 R26.2 R46.1 R48.1 R49.1 R73.2 R82.2 R83.2 R84.2 R85.2 R86.2 U22.H6(VDDIO_BANK3) U22.K7(VDDIO_BANK1) U22.M7(VDDIO_BANK4) U22.R11(VDDIO_BANK2) U22.R13(VDDIO_BANK0) U22.R15(VDDIO_BANK5) ; also on sheet 11 12
VDD_5V: R28.2 R29.2 ; also on sheet 11 12
24M_XIN: C43.2 R25.1 U22.B8(CLK24M_XIN) Y2.1
24M_XOUT: C44.2 R25.2 U22.A8(CLK24M_XOUT) Y2.3
32K768_XIN: C41.2 U22.B12(CLK32K768_XIN) Y1.2(P2)
32K768_XOUT: C42.2 U22.A12(CLK32K768_XOUT) Y1.1(P1)
ADC0: U22.C2(ADC_0)
ADC1: U22.D2(ADC_1)
ADC2: U22.B1(ADC_2)
ADC3: U22.G3(ADC_3)
ADC4: U22.C1(ADC_4)
ADC5: U22.D1(ADC_5)
ADC_1V8_POWER: C45.2 R35.1 U22.F8(AVDD1P8_ADC) ; also on sheet 11 12
BANK0_GPIO2: U22.W15(GPIO2/JTAG_TCK/PULSE_CNTR0)
BANK0_GPIO3: U22.V15(GPIO3/JTAG_TDI/PULSE_CNTR1/UART1_TXD)
BANK0_GPIO4: U22.Y15(GPIO4/JTAG_TDO/PULSE_CNTR2/UART1_RXD)
BANK1_GPIO14: U22.J5(GPIO14/OSPI_CS/QSPI0_CS0)
BANK1_GPIO15: U22.K1(GPIO15/OSPI_CLK/QSPI0_CLK)
BANK1_GPIO16: U22.K2(GPIO16/OSPI_D0/QSPI1_CS4/QSPI0_D0)
BANK1_GPIO17: U22.K4(GPIO17/OSPI_D1/QSPI1_CS3/QSPI0_D1)
BANK1_GPIO18: U22.K5(GPIO18/OSPI_D2/QSPI1_CS2/QSPI0_D2)
BANK1_GPIO19: U22.L1(GPIO19/OSPI_D3/QSPI1_CS1/QSPI0_D3)
BANK1_GPIO20: U22.L2(GPIO20/OSPI_D4/QSPI1_CS0/PULSE_CNTR0)
BANK2_GPIO26: U22.U11(GPIO26/MMC1_CLK/PDM_CLK)
BANK2_GPIO27: U22.W13(GPIO27/MMC1_CMD/PULSE_CNTR5/PDM_IN0)
BANK2_GPIO29: U22.V11(GPIO29/MMC1_D1/UART3_RXD/3D_CTRL_IN)
BANK2_GPIO30: U22.V10(GPIO30/MMC1_D2/UART3_RTS/3D_CTRL_OUT1)
BANK2_GPIO31: U22.V9(GPIO31/MMC1_D3/UART3_CTS/3D_CTRL_OUT2)
BANK2_GPIO32: U22.U10(GPIO32/IIC0_SCL/IIS_CLK/UART3_TXD)
BANK2_GPIO33: U22.T11(GPIO33/IIC0_SDA/IIS_WS/UART3_RXD)
BANK2_GPIO34: U22.U9(GPIO34/IIC1_SCL/IIS_D_IN0/PDM_IN3/UART3_RTS)
BANK2_GPIO35: U22.W12(GPIO35/IIC1_SDA/IIS_D_OUT0/PDM_IN1/UART3_CTS)
BANK2_GPIO36: U22.T10(GPIO36/IIC3_SCL/IIS_D_IN1/PDM_IN2/UART4_TXD)
BANK2_GPIO37: U22.Y12(GPIO37/IIC3_SDA/IIS_D_OUT1/PDM_IN0/UART4_RXD)
BANK3_GPIO42: U22.H1(GPIO42/UART1_RTS/PWM0/QSPI1_D2)
BANK3_GPIO43: U22.J6(GPIO43/UART1_CTS/PWM1/QSPI1_D3)
BANK3_GPIO46: U22.H4(GPIO46/UART2_RTS/PWM2/IIC4_SCL)
BANK3_GPIO47: U22.H5(GPIO47/UART2_CTS/PWM3/IIC4_SDA)
BANK4_GPIO52: U22.M3(GPIO52/UART3_RTS/PWM4/IIC3_SCL)
BANK4_GPIO53: U22.N4(GPIO53/UART3_CTS/PWM5/IIC3_SDA)
BANK5_GPIO62: U22.T14(GPIO62/M_CLK2/UART3_DE)
BANK5_GPIO63: U22.U15(GPIO63/M_CLK3/UART3_RE)
BOOT0: R33.2 R37.1 SW2.1 SW2.2 TP15.1 U22.C8(GPIO0/BOOT0)
BOOT1: R34.2 R38.1 TP16.1 U22.C9(GPIO1/BOOT1)
CAM0_SCL: TP19.1 U22.G4(GPIO48/UART4_TXD/IIC0_SCL/SPI2AXI_DIN)
CAM0_SDA: TP20.1 U22.G5(GPIO49/UART4_RXD/IIC0_SDA/SPI2AXI_DOUT)
CAM1_SCL: TP21.1 U22.J2(GPIO40/UART1_TXD/IIC1_SCL/QSPI1_D0)
CAM1_SDA: TP22.1 U22.J1(GPIO41/UART1_RXD/IIC1_SDA/QSPI1_D1)
CAM2_RST: FPC7.5 U22.T12(GPIO13/M_CLK1)
CAM2_SCL: FPC7.3 R48.2 TP17.1 U22.W14(GPIO7/PWM2/IIC4_SCL)
CAM2_SDA: FPC7.2 R49.2 TP18.1 U22.U12(GPIO8/PWM3/IIC4_SDA)
CSI0_CLK_N: U22.Y2(MIPI_RX0_CLK_N)
CSI0_CLK_P: U22.W2(MIPI_RX0_CLK_P)
CSI0_D0_N: U22.W3(MIPI_RX0_D0_N)
CSI0_D0_P: U22.Y3(MIPI_RX0_D0_P)
CSI0_D1_N: U22.V1(MIPI_RX0_D1_N)
CSI0_D1_P: U22.V2(MIPI_RX0_D1_P)
CSI1_CLK_N: U22.W5(MIPI_RX1_CLK_N)
CSI1_CLK_P: U22.Y5(MIPI_RX1_CLK_P)
CSI1_D2_N: U22.Y4(MIPI_RX1_D2_N)
CSI1_D2_P: U22.W4(MIPI_RX1_D2_P)
CSI1_D3_N: U22.W6(MIPI_RX1_D3_N)
CSI1_D3_P: U22.Y6(MIPI_RX1_D3_P)
CSI2_CLK_N: FPC7.15 U22.R2(MIPI_RX2_CLK_N)
CSI2_CLK_P: FPC7.14 U22.R1(MIPI_RX2_CLK_P)
CSI2_D4_N: FPC7.21 U22.T1(MIPI_RX2_D4_N)
CSI2_D4_P: FPC7.20 U22.T2(MIPI_RX2_D4_P)
CSI2_D5_N: FPC7.18 U22.U2(MIPI_RX2_D5_N)
CSI2_D5_P: FPC7.17 U22.U1(MIPI_RX2_D5_P)
DDR_CAA0: U22.M19(DDR_CAA0) U23.H2(CA0_a)
DDR_CAA1: U22.L16(DDR_CAA1) U23.J2(CA1_a)
DDR_CAA2: U22.N19(DDR_CAA2) U23.H9(CA2_a)
DDR_CAA3: U22.N20(DDR_CAA3) U23.H10(CA3_a)
DDR_CAA4: U22.M18(DDR_CAA4) U23.H11(CA4_a)
DDR_CAA5: U22.P19(DDR_CAA5) U23.J11(CA5_a)
DDR_CAB0: U22.E20(DDR_CAB0) U23.R2(CA0_b)
DDR_CAB1: U22.G19(DDR_CAB1) U23.P2(CA1_b)
DDR_CAB2: U22.G18(DDR_CAB2) U23.R9(CA2_b)
DDR_CAB3: U22.H17(DDR_CAB3) U23.R10(CA3_b)
DDR_CAB4: U22.F17(DDR_CAB4) U23.R11(CA4_b)
DDR_CAB5: U22.F19(DDR_CAB5) U23.P11(CA5_b)
DDR_CKEA0: U22.N17(DDR_CKEA0) U23.J4(CKE_a)
DDR_CKEB0: U22.J18(DDR_CKEB0) U23.P4(CKE_b)
DDR_CLKA_N: U22.R20(DDR_CLKAN) U23.J9(CK_c_a)
DDR_CLKA_P: U22.R19(DDR_CLKAP) U23.J8(CK_t_a)
DDR_CLKB_N: U22.F20(DDR_CLKBN) U23.P9(CK_c_b)
DDR_CLKB_P: U22.G20(DDR_CLKBP) U23.P8(CK_t_b)
DDR_CSA0: U22.T20(DDR_CSA0) U23.H4(CS_a)
DDR_CSB0: U22.J20(DDR_CSB0) U23.R4(CS_b)
DDR_DMIA0: U22.V17(DDR_DMIA0) U23.C3(DMIO_a)
DDR_DMIA1: U22.P17(DDR_DMIA1) U23.C10(DMI1_a)
DDR_DMIB0: U22.C15(DDR_DMIB0) U23.Y3(DMI0_b)
DDR_DMIB1: U22.D18(DDR_DMIB1) U23.Y10(DMI1_b)
DDR_DQA0: U22.Y16(DDR_DQA3) U23.B2(DQ0_a)
DDR_DQA1: U22.V16(DDR_DQA2) U23.C2(DQ1_a)
DDR_DQA2: U22.U17(DDR_DQA7) U23.E2(DQ2_a)
DDR_DQA3: U22.T16(DDR_DQA1) U23.F2(DQ3_a)
DDR_DQA4: U22.U16(DDR_DQA0) U23.F4(DQ4_a)
DDR_DQA5: U22.V18(DDR_DQA5) U23.E4(DQ5_a)
DDR_DQA6: U22.W18(DDR_DQA4) U23.C4(DQ6_a)
DDR_DQA7: U22.Y18(DDR_DQA6) U23.B4(DQ7_a)
DDR_DQA8: U22.W19(DDR_DQA12) U23.B11(DQ8_a)
DDR_DQA9: U22.T17(DDR_DQA15) U23.C11(DQ9_a)
DDR_DQA10: U22.P16(DDR_DQA14) U23.E11(DQ10_a)
DDR_DQA11: U22.R17(DDR_DQA8) U23.F11(DQ11_a)
DDR_DQA12: U22.R18(DDR_DQA10) U23.F9(DQ12_a)
DDR_DQA13: U22.T18(DDR_DQA9) U23.E9(DQ13_a)
DDR_DQA14: U22.U18(DDR_DQA13) U23.C9(DQ14_a)
DDR_DQA15: U22.U20(DDR_DQA11) U23.B9(DQ15_a)
DDR_DQB0: U22.A14(DDR_DQB3) U23.AA2(DQ0_b)
DDR_DQB1: U22.A17(DDR_DQB4) U23.Y2(DQ1_b)
DDR_DQB2: U22.C14(DDR_DQB0) U23.V2(DQ2_b)
DDR_DQB3: U22.B14(DDR_DQB2) U23.U2(DQ3_b)
DDR_DQB4: U22.D14(DDR_DQB1) U23.U4(DQ4_b)
DDR_DQB5: U22.B16(DDR_DQB5) U23.V4(DQ5_b)
DDR_DQB6: U22.C16(DDR_DQB6) U23.Y4(DQ6_b)
DDR_DQB7: U22.B17(DDR_DQB7) U23.AA4(DQ7_b)
DDR_DQB8: U22.C18(DDR_DQB12) U23.AA11(DQ8_b)
DDR_DQB9: U22.C17(DDR_DQB15) U23.Y11(DQ9_b)
DDR_DQB10: U22.D17(DDR_DQB13) U23.V11(DQ10_b)
DDR_DQB11: U22.E17(DDR_DQB10) U23.U11(DQ11_b)
DDR_DQB12: U22.E18(DDR_DQB11) U23.U9(DQ12_b)
DDR_DQB13: U22.D16(DDR_DQB14) U23.V9(DQ13_b)
DDR_DQB14: U22.C19(DDR_DQB8) U23.Y9(DQ14_b)
DDR_DQB15: U22.B19(DDR_DQB9) U23.AA9(DQ15_b)
DDR_DQSA0_N: U22.Y17(DDR_DQSA0N) U23.E3(DQS0_c_a)
DDR_DQSA0_P: U22.W17(DDR_DQSA0P) U23.D3(DQS0_t_a)
DDR_DQSA1_N: U22.V19(DDR_DQSA1N) U23.E10(DQS1_c_a)
DDR_DQSA1_P: U22.V20(DDR_DQSA1P) U23.D10(DQS1_t_a)
DDR_DQSB0_N: U22.A15(DDR_DQSB0N) U23.V3(DQS0_c_b)
DDR_DQSB0_P: U22.B15(DDR_DQSB0P) U23.W3(DQS0_t_b)
DDR_DQSB1_N: U22.A18(DDR_DQSB1N) U23.V10(DQS1_c_b)
DDR_DQSB1_P: U22.B18(DDR_DQSB1P) U23.W10(DQS1_t_b)
DDR_RESET: U22.J16(DDR_RESET) U23.T11(RESET_n)
DDR_VREF: C98.2 C99.1 C100.1 R43.2 R44.1 U22.K17(DDR_VREF)
DSI_CLK_N: U22.W9(MIPI_TX0_CLK_N)
DSI_CLK_P: U22.Y9(MIPI_TX0_CLK_P)
DSI_D0_N: U22.Y10(MIPI_TX0_D0_N)
DSI_D0_P: U22.W10(MIPI_TX0_D0_P)
DSI_D1_N: U22.W11(MIPI_TX0_D1_N)
DSI_D1_P: U22.Y11(MIPI_TX0_D1_P)
DSI_D2_N: U22.Y8(MIPI_TX1_D2_N)
DSI_D2_P: U22.W8(MIPI_TX1_D2_P)
DSI_D3_N: U22.W7(MIPI_TX1_D3_N)
DSI_D3_P: U22.Y7(MIPI_TX1_D3_P)
GPIO9: U22.T13(GPIO9/PWM4/UART1_TXD/IIC1_SCL)
GPIO10: U22.U13(GPIO10/3D_CTRL_IN/UART1_RXD/IIC1_SDA)
GPIO11: U22.Y14(GPIO11/3D_CTRL_OUT1/UART2_TXD/IIC2_SCL)
GPIO12: U22.V13(GPIO12/3D_CTRL_OUT2/UART2_RXD/IIC2_SDA)
GPIO60: U22.P5(GPIO60/PWM0/IIC0_SCL/QSPI0_CS2/HSYNC1)
GPIO61: U22.P4(GPIO61/PWM1/IIC0_SDA/QSPI0_CS1/VSYNC1)
HDMI_CSCL: TP23.1 U22.H2(GPIO44/UART2_TXD/IIC3_SCL/SPI2AXI_CLK)
HDMI_CSDA: TP24.1 U22.H3(GPIO45/UART2_RXD/IIC3_SDA/SPI2AXI_CS)
HDMI_INT: U22.L5(GPIO23/OSPI_D7/QSPI1_D1/PULSE_CNTR3)
HDMI_RSTN: U22.L6(GPIO24/OSPI_DQS/QSPI1_D2/PULSE_CNTR4)
HP_OUTL: U22.G1(HP_OUTL)
HP_OUTR: U22.G2(HP_OUTR)
INT4: R35.2 U22.C12(GPIO68/INT4)
LCD_EN: U22.M1(GPIO25/PWM5/QSPI1_D3/PULSE_CNTR5)
LCD_RST: U22.L4(GPIO22/OSPI_D6/QSPI1_D0/PULSE_CNTR2)
MCLK1: FPC7.6 R46.2 U22.L3(GPIO21/OSPI_D5/QSPI1_CLK/PULSE_CNTR1)
MIC_BIAS: U22.E3(MIC_BIAS)
MIC_NR: U22.F2(MIC_NR)
MIC_PR: U22.F1(MIC_PR)
OUT0: U22.B11(GPIO70/OUT0) ; also on sheet 11
PRE_VDD_5V: C1.1 C10.2 C11.2 D1.5(VCC) L1.2 R8.2 TP3.1 U2.1(VOUT) ; also on sheet 11
RSTN: C46.1 R32.2 SW1.1 SW1.2 TP14.1 U22.B9(RSTN)
TFCARD_CLK: CARD1.5(CLX) TP27.1 U22.N2(GPIO55/QSPI0_CLK/MMC1_CLK/PWM1)
TFCARD_CMD: CARD1.3(CMD) R82.1 TP28.1 U22.M2(GPIO54/QSPI0_CS0/MMC1_CMD/PWM0)
TFCARD_D0: CARD1.7(DAT0) R83.1 TP29.1 U22.P3(GPIO56/QSPI0_D0/MMC1_D0/PWM2)
TFCARD_D1: CARD1.8(DAT1) R84.1 TP30.1 U22.N1(GPIO57/QSPI0_D1/MMC1_D1/PWM3)
TFCARD_D2: CARD1.1(DAT2) R85.1 TP32.1 U22.P1(GPIO58/QSPI0_D2/MMC1_D2/PWM4)
TFCARD_D3: CARD1.2(CD/DAT3) R86.1 TP31.1 U22.P2(GPIO59/QSPI0_D3/MMC1_D3/PWM5)
UART0_RXD: R71.1 U22.J3(GPIO39/UART0_RXD/QSPI1_CLK/VSYNC0)
UART0_RXDA: CN2.2 D6.2(A) R71.2
UART0_TXD: R70.1 U22.J4(GPIO38/UART0_TXD/QSPI1_CS0/HSYNC0)
UART0_TXDA: CN2.3 D5.2(A) R70.2
UART2_RX: H1.2 U22.V14(GPIO6/JTAG_RST/PULSE_CNTR4/UART2_RXD)
UART2_TX: H1.1 U22.U14(GPIO5/JTAG_TMS/PULSE_CNTR3/UART2_TXD)
UART3_RXD: R77.1 U22.M4(GPIO51/UART3_RXD/IIC2_SDA/QSPI0_CS3)
UART3_RXDA: CN3.2 D8.2(A) R77.2
UART3_TXD: R76.1 U22.M5(GPIO50/UART3_TXD/IIC2_SCL/QSPI0_CS4)
UART3_TXDA: CN3.3 D7.2(A) R76.2
USB0_N: D1.1(I/O) D1.6(I/O) TP1.1 U1.A7(DN1(D-)) U1.B7(DN2(D-)) U22.B2(USB0_DN)
USB0_P: D1.3(I/O) D1.4(I/O) TP5.1 U1.A6(DP1(D+)) U1.B6(DP2(D+)) U22.A2(USB0_DP)
USB1_N: U22.A4(USB1_DN)
USB1_P: U22.B4(USB1_DP)
USB5V_IN+: C2.1 TP2.1 U1.A4B9(VBUS) U1.A9B4(VBUS) U2.4(EN) U2.5(VIN)
WIFI_CLK: U22.A5(MMC0_CLK)
WIFI_CMD: U22.D6(MMC0_CMD)
WIFI_D0: U22.D5(MMC0_D0)
WIFI_D1: U22.C5(MMC0_D1)
WIFI_D2: U22.B5(MMC0_D2)
WIFI_D3: U22.C6(MMC0_D3)
WIFI_REGON: U22.A6(MMC0_RST_N)
$3N184: R1.1 U2.3(SET)
$3N1304: R3.1 U1.B5(CC2)
$3N1319: R2.1 U1.A5(CC1)
$5N2187: C9.1 L1.1 U6.2(SW)
$5N2729: C12.2 R8.1 R10.2
$12N6716: C50.1 C51.1 U22.F3(CODEC_VCM)
$12N6722: R31.1 U22.C4(USB1_TXRTUNE)
$12N6724: R30.1 U22.D4(USB0_TXRTUNE)
$12N6726: R29.1 U22.A3(USB1_VBUS)
$12N6728: R28.1 U22.C3(USB0_VBUS)
$12N6798: R27.1 U22.B3(USB1_ID)
$12N9890: R26.1 U22.D3(USB0_ID)
$13N2671: R40.1 U22.K19(DDR_ZN)
$13N2673: R39.1 U23.G2(ODT_CA_a)
$13N2675: R41.1 U23.T2(ODT_CA_b)
$13N2683: R42.1 U23.A5(ZQ)
$14N2335: R45.2 U22.U7(MIPI_REXT)
Net-(C7-2): C7.2 C8.2 D3.1(C) F1.2 R7.2 U6.5(EN)
Net-(C9-2): C9.2 U6.4(FB)
Net-(C12-1): C12.1 R10.1 R11.2 U6.6(BOOT)
Net-(LED2-2): LED2.2(A) R73.1
Net-(R7-1): R7.1 R9.2 U6.3(VIN)

Not connected (* = marked no-connect by the designer): CARD1 9(CD(SD_CARD_DET))*; CN3 1; FPC7 8* 9* 11* 12*; SCREW1 1; SCREW2 1; SCREW3 1; SCREW4 1; U1 A8(SBU1)* B8(SBU2)*; U22 A7(MMC0_D5)* A10(GPIO66/INT2)* A11(GPIO67/INT3)* A20(NC)* B6(MMC0_STROBE)* B7(MMC0_D6)* B10(GPIO65/INT1)* C7(MMC0_D7)* C10(GPIO64/INT0)* C11(GPIO71/OUT1)* C20(DDR_NC)* D7(MMC0_D4)* D8(ANA_TS_VTEST)* D12(GPIO69/INT5)* D19(DDR_NC)* D20(DDR_NC)* E1(MIC_PL)* E2(MIC_NL)* F18(DDR_NC)* G17(DDR_NC)* H18(DDR_NC)* H19(DDR_NC)* J17(DDR_CKEB1)* J19(DDR_CSB1)* K20(DDR_NC)* L17(DDR_NC)* L18(DDR_NC)* L20(DDR_NC)* M17(DDR_NC)* M20(DDR_NA)* N18(DDR_NC)* P18(DDR_CKEA1)* T19(DDR_CSA1)* U6(MIPI_ATB)* V12(GPIO28/MMC1_D0/UART3_TXD/PDM_IN1)* Y1(NC)* Y20(NC)*

## Notes on the sheets
sheet 1
- 可焊接至外部供电
- TYPE-C
   5V输入
- 背部预留供电焊盘
- 搭配BST236A054U和
  MT9700实现过压过流防
  反接保护，防倒灌
- MAX@5V2A
- USB5V_IN+
- XC6206P182MR
  实现5V转1.8V给
  K230 RTC/ADC供电
- 一个反相器+两个MT9700实
  现双向输入输出的自动切换和
  过流保护，再加入TVS二极管
  搭配实现过压和反接保护
- 40P排针
  双调试口5V
  5V输入||输出
- MAX@5V2A
- PIN5V_OUT_IN+
- 双向供电
- PRE_VDD_5V
- MT9700|由K230自带
  PMU模块启动
- MAX@5V1A
- DCDC降压
  TPS54302DDCR
  8V至28V输入，5V输出
  加一个MT9700防倒灌
- TVS二极管搭配自恢复保
  险丝（2A）实现过压过流
  防反接保护
- OUT0
- EN
- GH1.25-2P
  8-24V输入
- MAX@28V2A
- 8V-24V_IN+
- 背部预留供电焊盘
- VDD0P8_CORE上电必须早于VDD1P8、VDDIO3P3_0到
  VDDIO3P3_5的IO接口上电，AVDD0P8_MIPI上电必须早
  于AVDD1P8_MIPI，AVDD1P8_RTC不晚于AVDD1P8_LDO，
  其余顺序无要求。
- VDD_5V
- 可接 3S锂电池
- MT9201
- 屏幕背光恒流输出
- TLV62569DBVR
- 0V8   供电
- TLV62569DBVR
- 1V1   供电
- TLV62569DBVR
- 1V8   供电
- TLV62569DBVR
- 3V3   供电
- 需加电容延迟上电
sheet 2
- I2C3和官方CANMV不一致，为了保留所有的IIS和PDM音频接口而更换
sheet 3
- 1.USB数据口静电防护
  2.钳位（过压）保护
  3.过流保护
  4.反接保护（是否能生效存疑）
- USB5V_IN+ 输入
- Iset:2A
sheet 4
- VCC 8-24V宽电压转5V
- 过压过流防反接保护
- 不要更新库，已修改原理图器件
sheet 5
- RGB
- 复位按钮
- 小核-linux占用
- BOOT0按钮
- 只支持3.3V，不得接入5V
- 电源指示灯
- 大核-RT-Smart占用
sheet 6
- 注意，预留出触点  方便烧录
- 不可同时使用
  只能选其一
- TF卡座
- 预留给可能会发生剧烈震动或要求高可靠性的场景
sheet 8
- Floating or pull up is device mode
- Force Host Mode
- BOOT0 = 0，BOOT1 = 0，SPI Nor
  BOOT0 = 0，BOOT1 = 1，eMMC
  BOOT0 = 1，BOOT1 = 0，SPI Nand
  BOOT0 = 1，BOOT1 = 1，SD Card
- K230D设计有PMU功能，可通过INT管脚检测外部事件，
  然后触发OUT输出，如检测外部按键长按后，OUT控
  制总电源的使能完成系统上电。不需要PMU功能可直
  接将VDD1V8_RTC和系统1V8接到一起即可
  前置条件：VDD1V8_RTC供电，32.768khz晶振提供
  INT0设计为长按3s后OUT0输出高电平
  INT4设计为检测到上拉，OUT0立即输出高电平
sheet 9
- 布线等长设计，注意添加pin delay
sheet 10
- 默认摄像头接口
